# EAGLE schematic MeshPoint.One (EAGLE 9.1.3)

## Sheet 1 of 10: 5V and 3V3 PSU
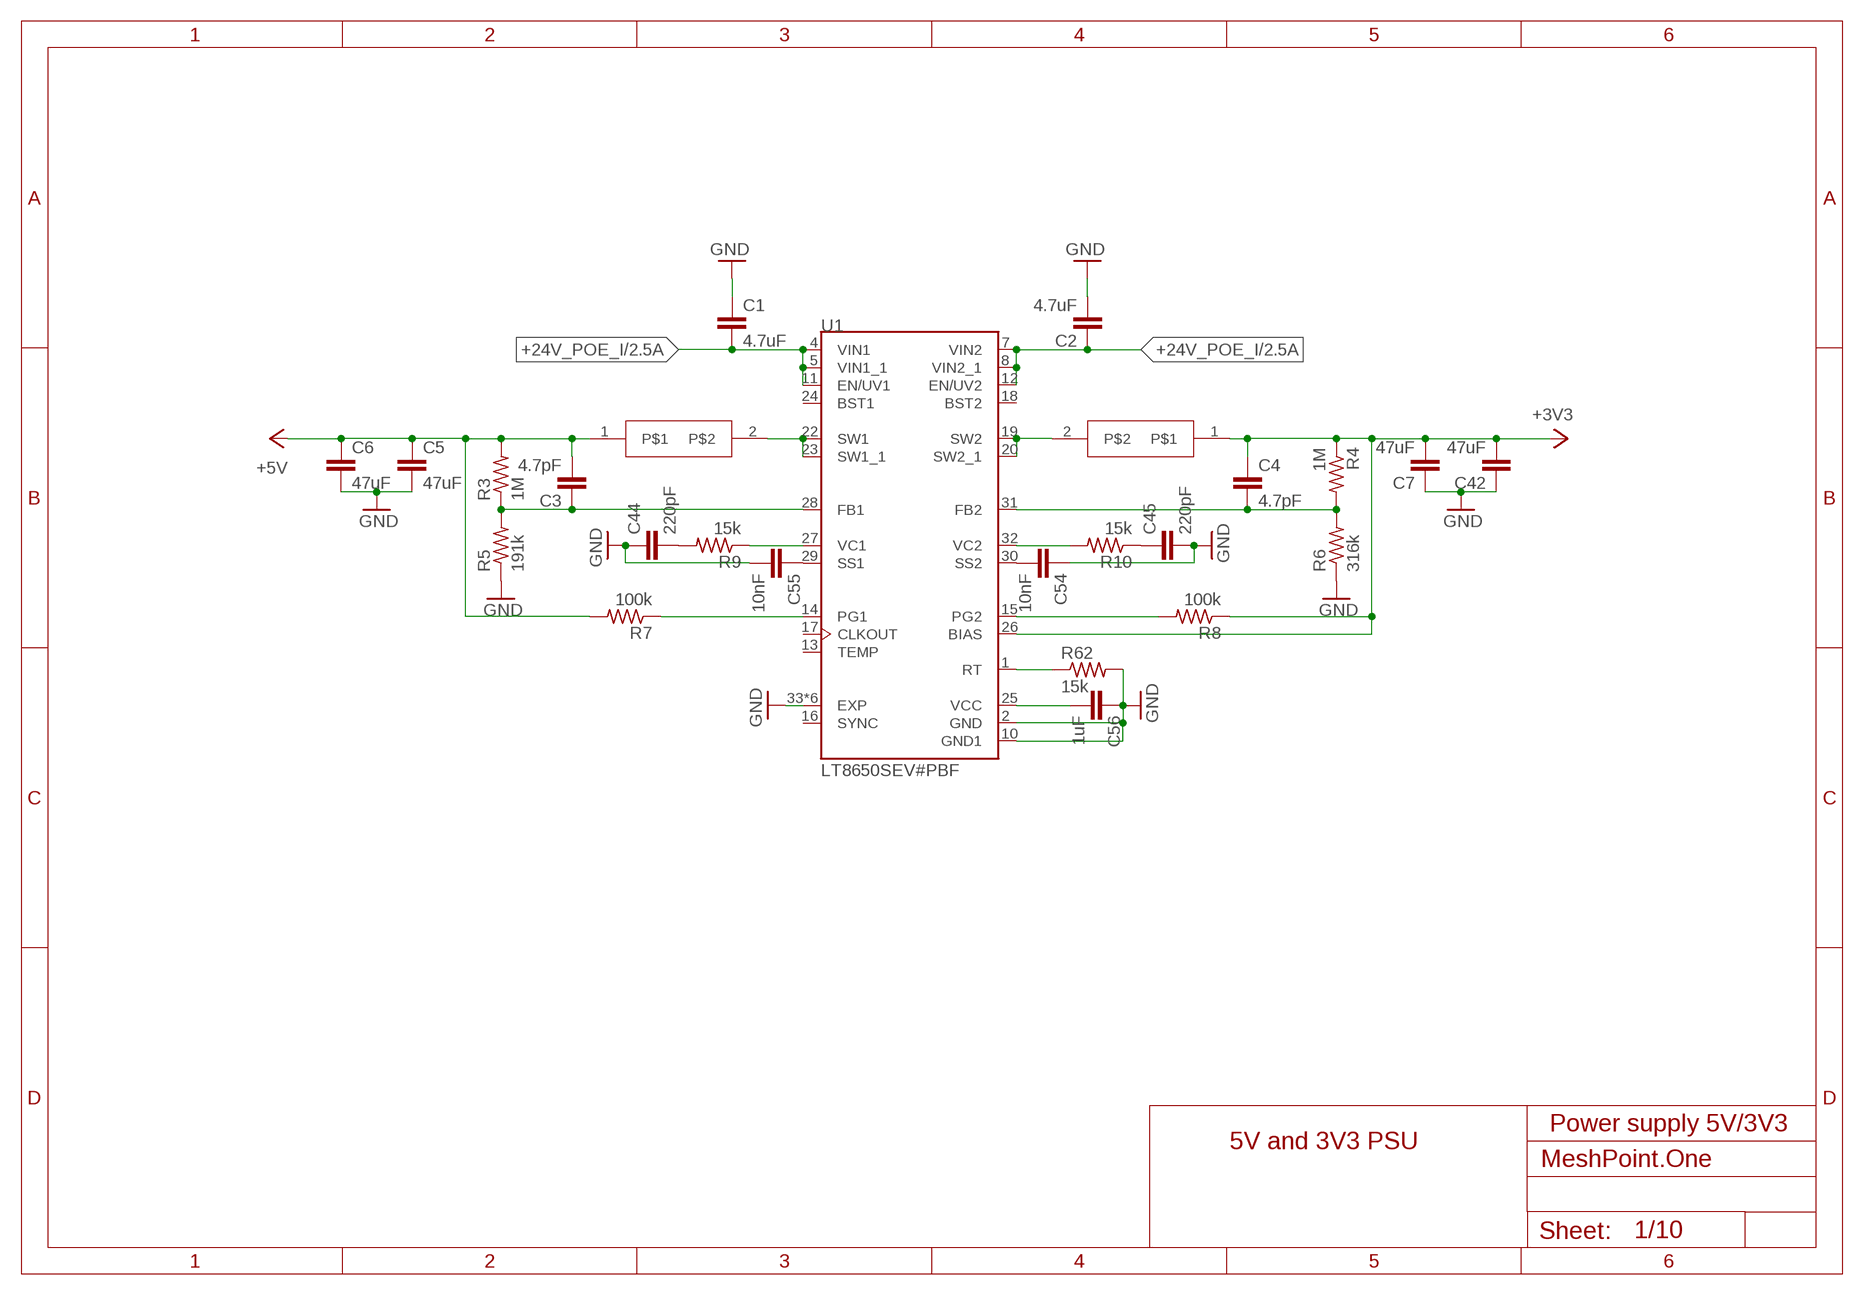
[diagram p0: schematic, sheet 1]

### Parts
C1  4.7uF  C-EUC1206  [C1206]
C2  4.7uF  C-EUC1206  [C1206]
C3  4.7pF  C-EUC0402  [C0402]
C4  4.7pF  C-EUC0402  [C0402]
C5  47uF  C-EUC1206  [C1206]
C6  47uF  C-EUC1206  [C1206]
C7  47uF  C-EUC1206  [C1206]
C42  47uF  C-EUC1206  [C1206]
C44  220pF  C-EUC0402  [C0402]
C45  220pF  C-EUC0402  [C0402]
C54  10nF  C-EUC0402  [C0402]
C55  10nF  C-EUC0402  [C0402]
C56  1uF  C-EUC0402  [C0402]
L1  PA4333.102NLTPA4333.102NLT  [INDC6932X320]
L2  PA4333.102NLTPA4333.102NLT  [INDC6932X320]
R3  1M  R-US_R0402  [R0402]
R4  1M  R-US_R0402  [R0402]
R5  191k  R-US_R0402  [R0402]
R6  316k  R-US_R0402  [R0402]
R7  100k  R-US_R0402  [R0402]
R8  100k  R-US_R0402  [R0402]
R9  15k  R-US_R0402  [R0402]
R10  15k  R-US_R0402  [R0402]
R62  15k  R-US_R0402  [R0402]
U1  LT8650SEV#PBF  [QFN50P600X400X103-32N240X440]

### Nets
+24V_POE_I: C1.2 C2.1 U1.4(VIN1) U1.5(VIN1_1) U1.7(VIN2) U1.8(VIN2_1) U1.11(EN/UV1) U1.12(EN/UV2) ; also sheet 2,3,10
GND: C1.1 C2.2 C5.2 C6.2 C7.1 C42.1 C44.1 C45.2 C54.1 C55.2 C56.1 R5.1 R6.1 R62.2 U1.2(GND) U1.10(GND1) U1.33(EXP) U1.34(EXP) U1.35(EXP) U1.36(EXP) U1.37(EXP) U1.38(EXP) ; also sheet 2,3,4,5,6,7,8,9,10
N$1: L1.2 U1.22(SW1) U1.23(SW1_1)
N$2: L2.2 U1.19(SW2) U1.20(SW2_1)
N$5: C3.1 R3.1 R5.2 U1.28(FB1)
N$6: C4.2 R4.2 R6.2 U1.31(FB2)
N$8: C55.1 U1.29(SS1)
N$9: R7.1 U1.14(PG1)
N$10: R8.2 U1.15(PG2)
N$12: C54.2 U1.30(SS2)
N$13: C44.2 R9.2
N$14: C45.1 R10.1
N$15: R9.1 U1.27(VC1)
N$19: R10.2 U1.32(VC2)
N$28: R62.1 U1.1(RT)
N$30: C56.2 U1.25(VCC)
N$226: C4.1 C7.2 C42.2 L2.1 R4.1 R8.1 U1.26(BIAS) ; supply symbol labelled +3V3 ; also sheet 3,6,7,10
N$301: C3.2 C5.1 C6.1 L1.1 R3.2 R7.2 ; supply symbol labelled +5V ; also sheet 5,10
Unconnected: U1.13(TEMP) U1.16(SYNC) U1.17(CLKOUT) U1.18(BST2) U1.24(BST1)

### Notes on the sheet
- Power supply 5V/3V3
- 5V and 3V3 PSU

## Sheet 2 of 10: POE 24V PSU
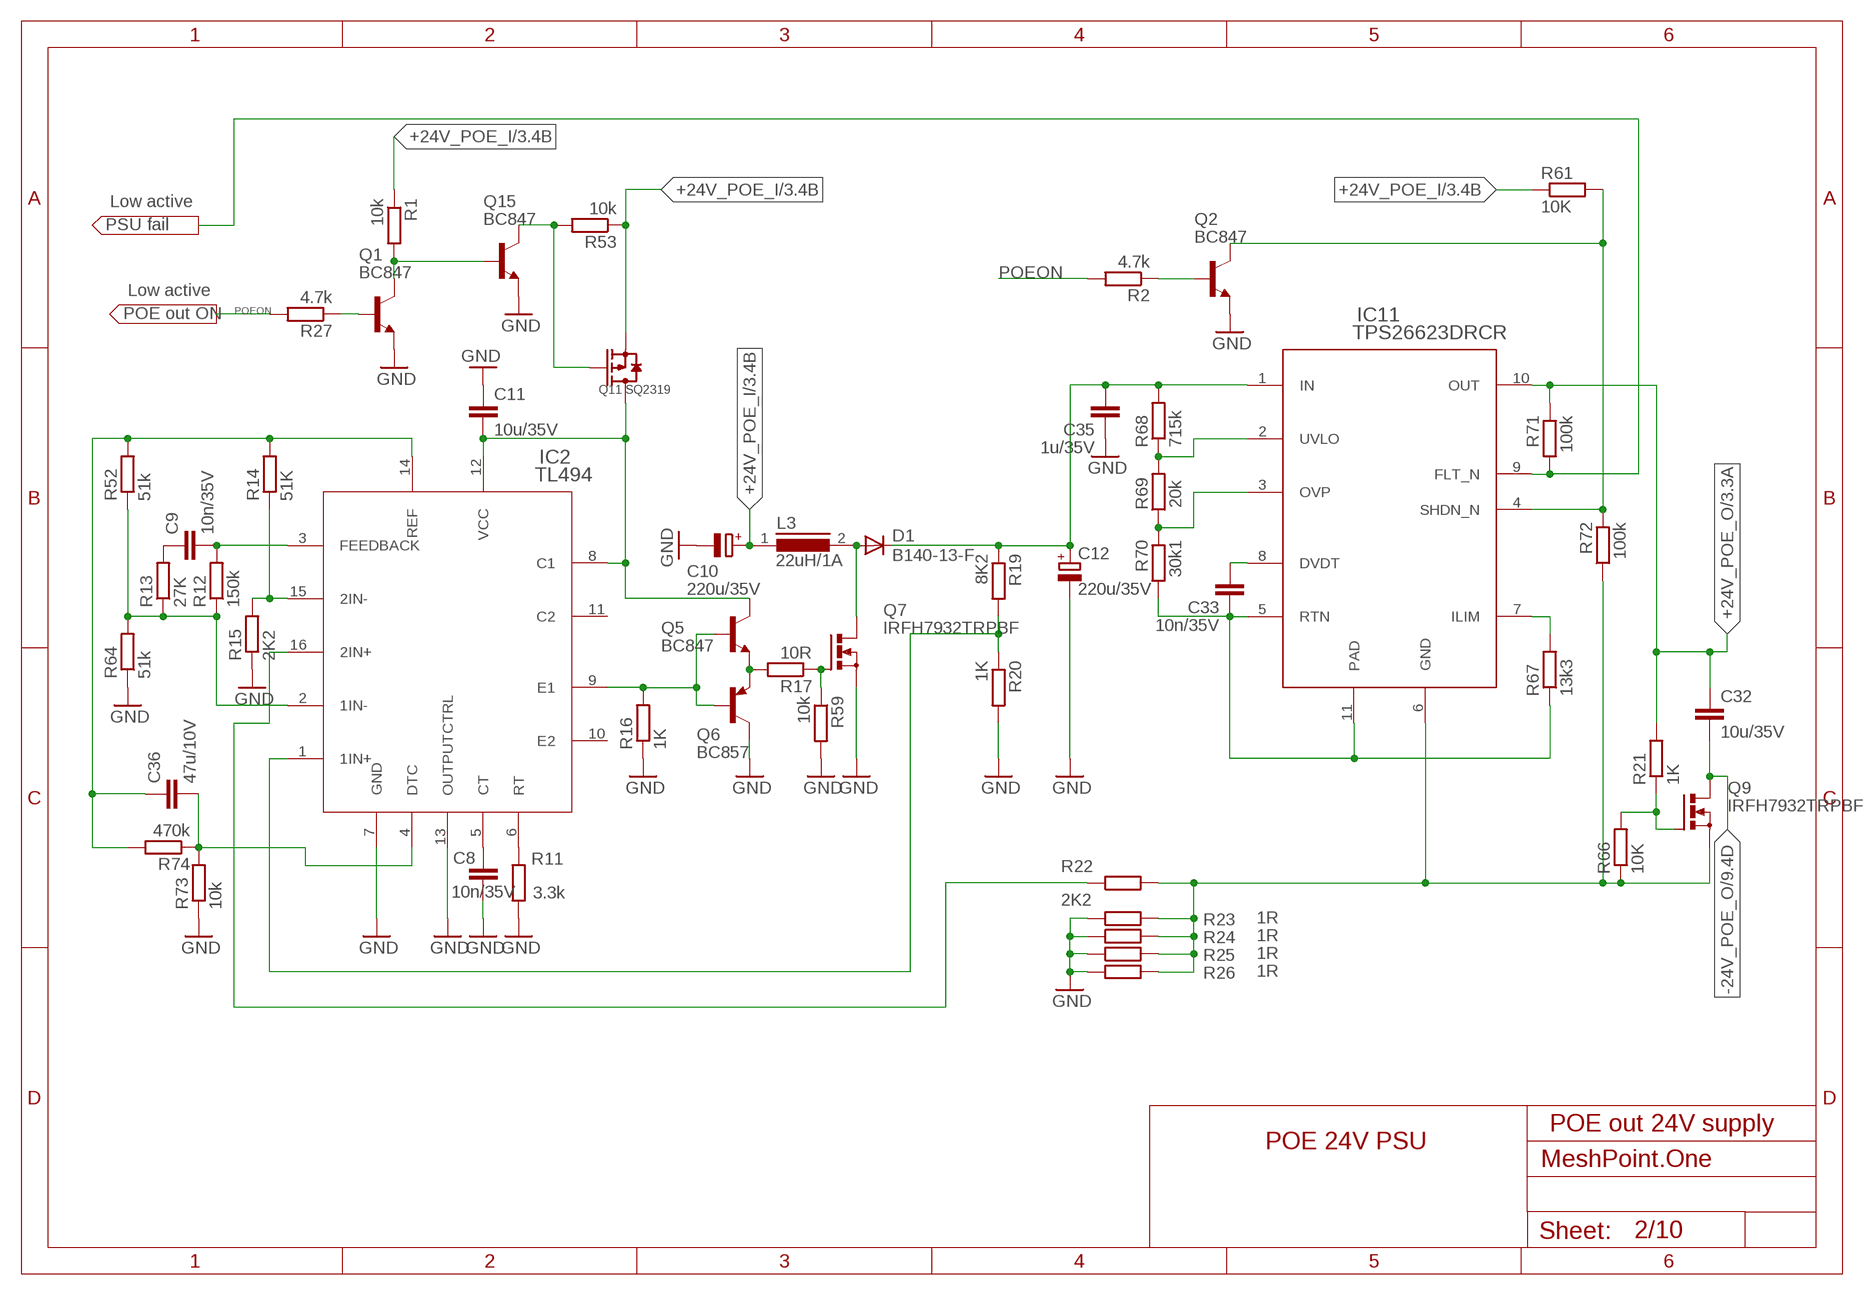
[diagram p1: schematic, sheet 2]

### Parts
C8  10n/35V  C-EUC0402  [C0402]
C9  10n/35V  C-EUC0402  [C0402]
C10  220u/35V  CPOL-EU153CLV-1010  [153CLV-1010]
C11  10u/35V  C-EUC1206  [C1206]
C12  220u/35V  CPOL-EU153CLV-1010  [153CLV-1010]
C32  10u/35V  C-EUC1206  [C1206]
C33  10n/35V  C-EUC0402  [C0402]
C35  1u/35V  C-EUC0402  [C0402]
C36  47u/10V  C-EUC1206  [C1206]
D1  B140-13-F  DIODE-SMB  [SMB]
IC2  TL494  TL494_PW_16  [PW16]
IC11  TPS26623DRCR  [DRC0010J]
L3  22uH/1A  DR125  [DR125]
Q1  BC847  BC847ALT1SMD  [SOT23]
Q2  BC847  BC847ALT1SMD  [SOT23]
Q5  BC847  BC847ASMD  [SOT23]
Q6  BC857  BC857ASMD  [SOT23-BEC]
Q7  IRFH7932TRPBF  BSZ105N04NS  [PG-TDSON-8]
Q9  IRFH7932TRPBF  BSZ105N04NS  [PG-TDSON-8]
Q11  SQ2319  SMD-MOSFET-P-CH-8V-4.1A-CJ2305(SOT-23)  [SOT-23:1]
Q15  BC847  BC847ALT1SMD  [SOT23]
R1  10k  R-EU_R0402  [R0402]
R2  4.7k  R-EU_R0402  [R0402]
R11  3.3k  R-EU_R0402  [R0402]
R12  150k  R-EU_R0402  [R0402]
R13  27K  R-EU_R0402  [R0402]
R14  51K  R-EU_R0402  [R0402]
R15  2K2  R-EU_R0402  [R0402]
R16  1K  R-EU_R0402  [R0402]
R17  10R  R-EU_R0402  [R0402]
R19  8K2  R-EU_R0402  [R0402]
R20  1K  R-EU_R0402  [R0402]
R21  1K  R-EU_R0402  [R0402]
R22  2K2  R-EU_R0402  [R0402]
R23  1R  R-EU_M1206  [M1206]
R24  1R  R-EU_M1206  [M1206]
R25  1R  R-EU_M1206  [M1206]
R26  1R  R-EU_M1206  [M1206]
R27  4.7k  R-EU_R0402  [R0402]
R52  51k  R-EU_R0402  [R0402]
R53  10k  R-EU_R0402  [R0402]
R59  10k  R-EU_R0402  [R0402]
R61  10K  R-EU_R0402  [R0402]
R64  51k  R-EU_R0402  [R0402]
R66  10K  R-EU_R0402  [R0402]
R67  13k3  R-EU_R0402  [R0402]
R68  715k  R-EU_R0402  [R0402]
R69  20k  R-EU_R0402  [R0402]
R70  30k1  R-EU_R0402  [R0402]
R71  100k  R-EU_R0402  [R0402]
R72  100k  R-EU_R0402  [R0402]
R73  10k  R-EU_R0402  [R0402]
R74  470k  R-EU_R0402  [R0402]

### Nets
+24V_POE_I: C10.+ L3.1 Q11.2(S) R1.1 R53.1 R61.1 ; also sheet 1,3,10
+24V_POE_O: C32.1 IC11.10(OUT) R21.2 R71.2 ; also sheet 3,10
-24V_POE_O: C32.2 Q9.5(D) Q9.6(D) Q9.7(D) Q9.8(D) Q9.TH(D) ; also sheet 9,10
GND: C8.2 C10.- C11.1 C12.- C35.1 IC2.7(GND) IC2.13(OUTPUTCTRL) Q1.2(E) Q2.2(E) Q6.C Q7.1(S) Q7.2(S) Q7.3(S) Q15.2(E) R11.1 R15.1 R16.1 R20.2 R23.1 R24.1 R25.1 R26.1 R59.2 R64.1 R73.1 ; also sheet 1,3,4,5,6,7,8,9,10
N$11: IC2.6(RT) R11.2
N$16: C8.1 IC2.5(CT)
N$17: C36.2 IC2.4(DTC) R73.2 R74.1
N$18: C9.2 IC2.3(FEEDBACK) R12.2
N$21: Q1.1(B) R27.1
N$22: IC2.15(2IN-) R14.1 R15.2
N$23: IC2.9(E1) Q5.1(B) Q6.B R16.2
N$24: Q5.2(E) Q6.E R17.2
N$25: C36.1 IC2.14(REF) R14.2 R52.2 R74.2
N$27: Q7.4(G) R17.1 R59.1
N$31: IC2.1(1IN+) R19.2 R20.1
N$32: C33.2 IC11.8(DVDT)
N$35: IC2.16(2IN+) R22.1
N$37: Q1.3(C) Q15.1(B) R1.2
N$73: Q2.1(B) R2.1
N$74: C9.1 R13.2
N$89: IC11.4(SHDN_N) Q2.3(C) R61.2 R72.2
N$91: C12.+ C35.2 D1.C IC11.1(IN) R19.1 R68.2
N$113: Q11.1(G) Q15.3(C) R53.2
N$115: C11.2 IC2.8(C1) IC2.12(VCC) Q5.3(C) Q11.3(D)
N$128: Q9.4(G) R21.1 R66.2
N$186: IC11.7(ILIM) R67.2
N$190: D1.A L3.2 Q7.5(D) Q7.6(D) Q7.7(D) Q7.8(D) Q7.TH(D)
N$194: C33.1 IC11.5(RTN) IC11.11(PAD) R67.1 R70.1
N$208: IC11.6(GND) Q9.1(S) Q9.2(S) Q9.3(S) R22.2 R23.2 R24.2 R25.2 R26.2 R66.1 R72.1
N$234: IC2.2(1IN-) R12.1 R13.1 R52.1 R64.2
N$249: IC11.2(UVLO) R68.1 R69.2
N$250: IC11.3(OVP) R69.1 R70.2
POEON: R2.2 R27.2 ; also sheet 10
PSU_FAIL: IC11.9(FLT_N) R71.1
Unconnected: IC2.10(E2) IC2.11(C2)

### Notes on the sheet
- Low active
- Low active
- POE out 24V supply
- POE 24V PSU

## Sheet 3 of 10: INA voltage/current monitor
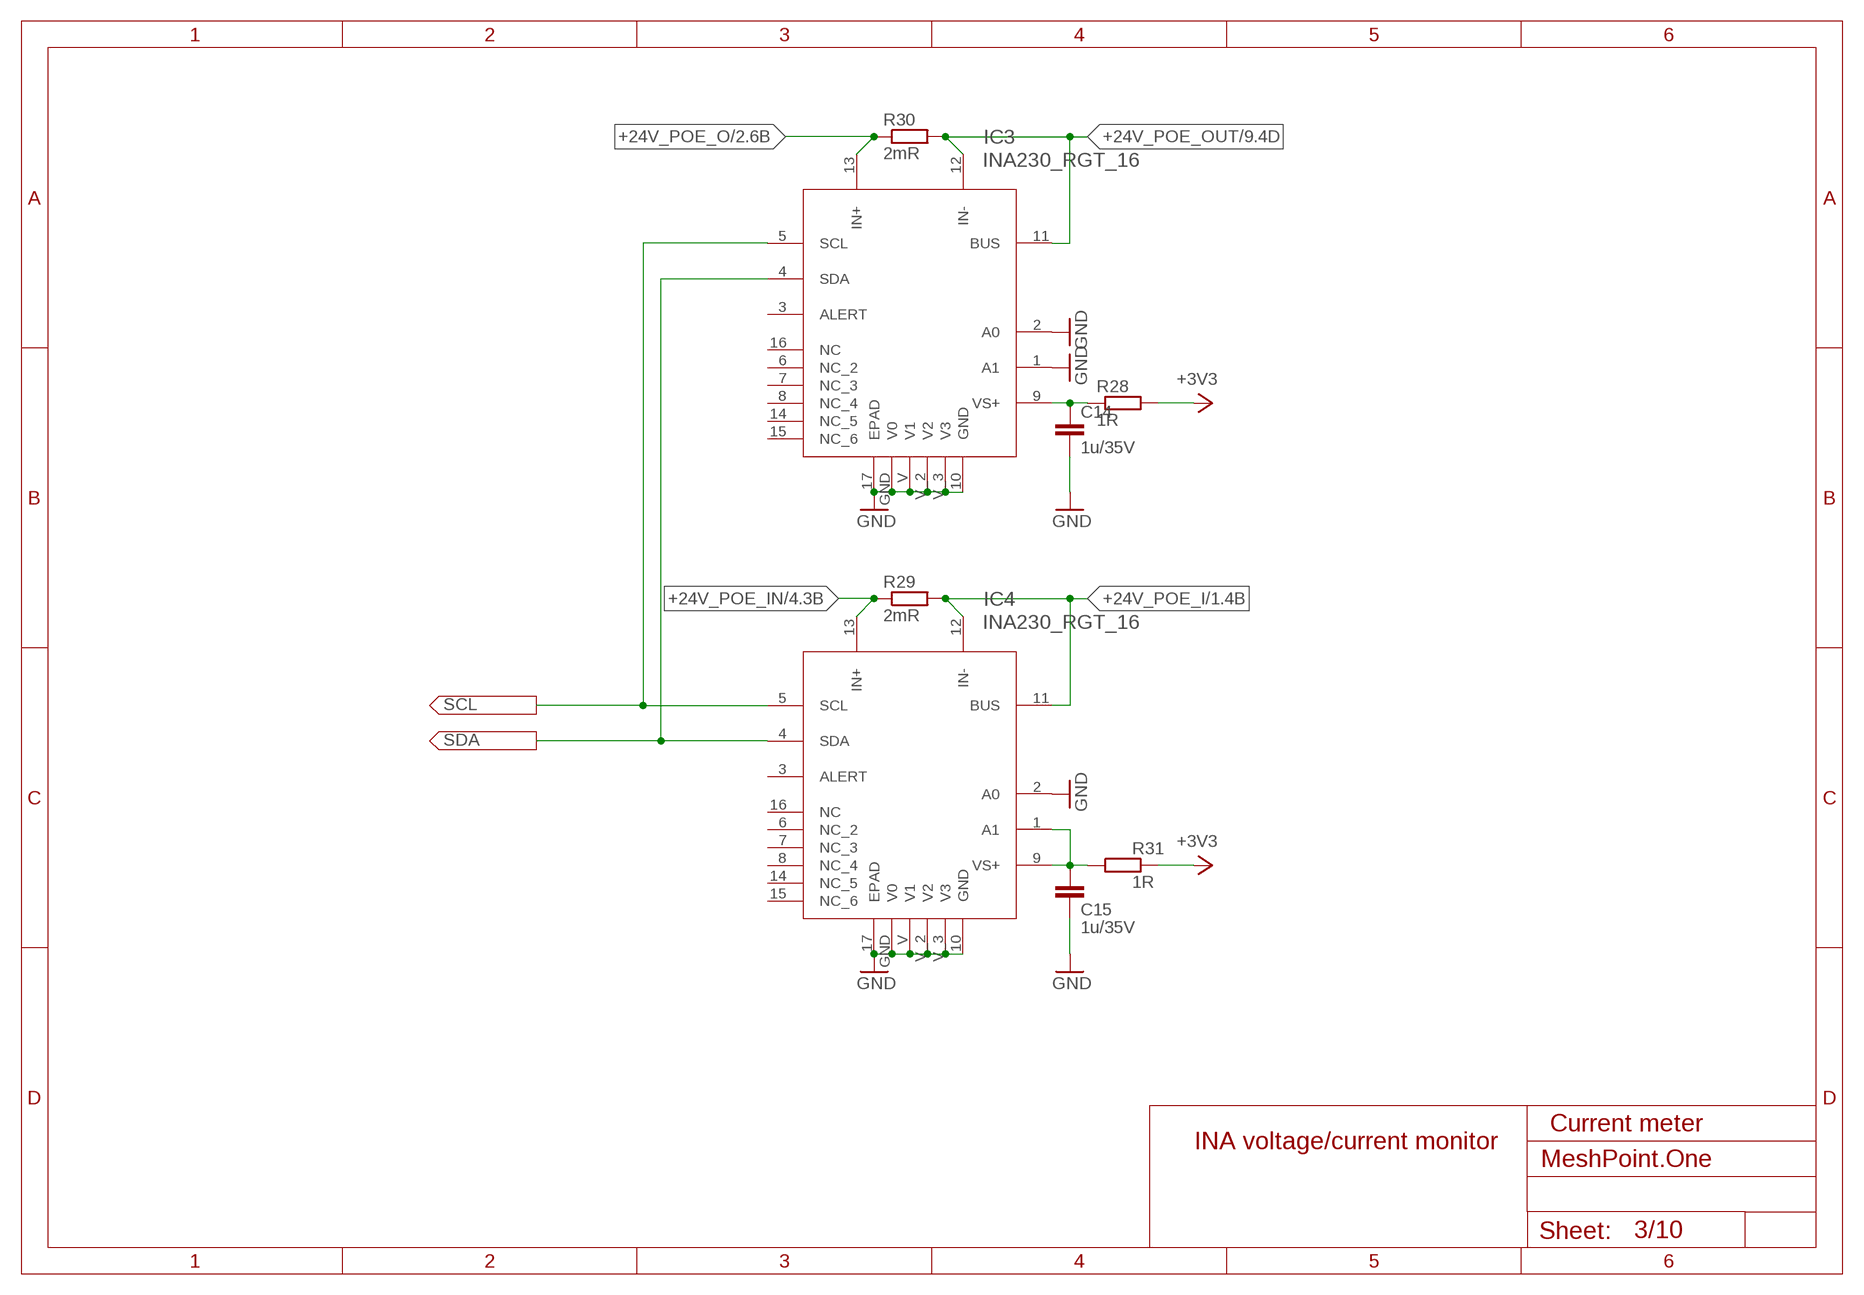
[diagram p2: schematic, sheet 3]

### Parts
C14  1u/35V  C-EUC0402  [C0402]
C15  1u/35V  C-EUC0402  [C0402]
IC3  INA230_RGT_16  [RGT16_1P7X1P7]
IC4  INA230_RGT_16  [RGT16_1P7X1P7]
R28  1R  R-EU_R0402  [R0402]
R29  2mR  R-EU_M1206  [M1206]
R30  2mR  R-EU_M1206  [M1206]
R31  1R  R-EU_R0402  [R0402]

### Nets
+24V_POE_I: IC4.11(BUS) IC4.12(IN-) R29.2 ; also sheet 1,2,10
+24V_POE_IN: IC4.13(IN+) R29.1 ; also sheet 4,8
+24V_POE_O: IC3.13(IN+) R30.1 ; also sheet 2,10
+24V_POE_OUT: IC3.11(BUS) IC3.12(IN-) R30.2 ; also sheet 9
GND: C14.2 C15.2 IC3.1(A1) IC3.2(A0) IC3.10(GND) IC3.17(EPAD) IC3.GND(V0) IC3.V(V1) IC3.V_2(V2) IC3.V_3(V3) IC4.2(A0) IC4.10(GND) IC4.17(EPAD) IC4.GND(V0) IC4.V(V1) IC4.V_2(V2) IC4.V_3(V3) ; also sheet 1,2,4,5,6,7,8,9,10
N$34: C14.1 IC3.9(VS+) R28.1
N$36: C15.1 IC4.1(A1) IC4.9(VS+) R31.1
N$226: R28.2 R31.2 ; supply symbol labelled +3V3 ; also sheet 1,6,7,10
SCL: IC3.5(SCL) IC4.5(SCL) ; also sheet 4,6,7,10
SDA: IC3.4(SDA) IC4.4(SDA) ; also sheet 4,6,7,10
Unconnected: IC3.3(ALERT) IC3.6(NC_2) IC3.7(NC_3) IC3.8(NC_4) IC3.14(NC_5) IC3.15(NC_6) IC3.16(NC) IC4.3(ALERT) IC4.6(NC_2) IC4.7(NC_3) IC4.8(NC_4) IC4.14(NC_5) IC4.15(NC_6) IC4.16(NC)

### Notes on the sheet
- Current meter
- INA voltage/current monitor

## Sheet 4 of 10: POE/BATT power selector
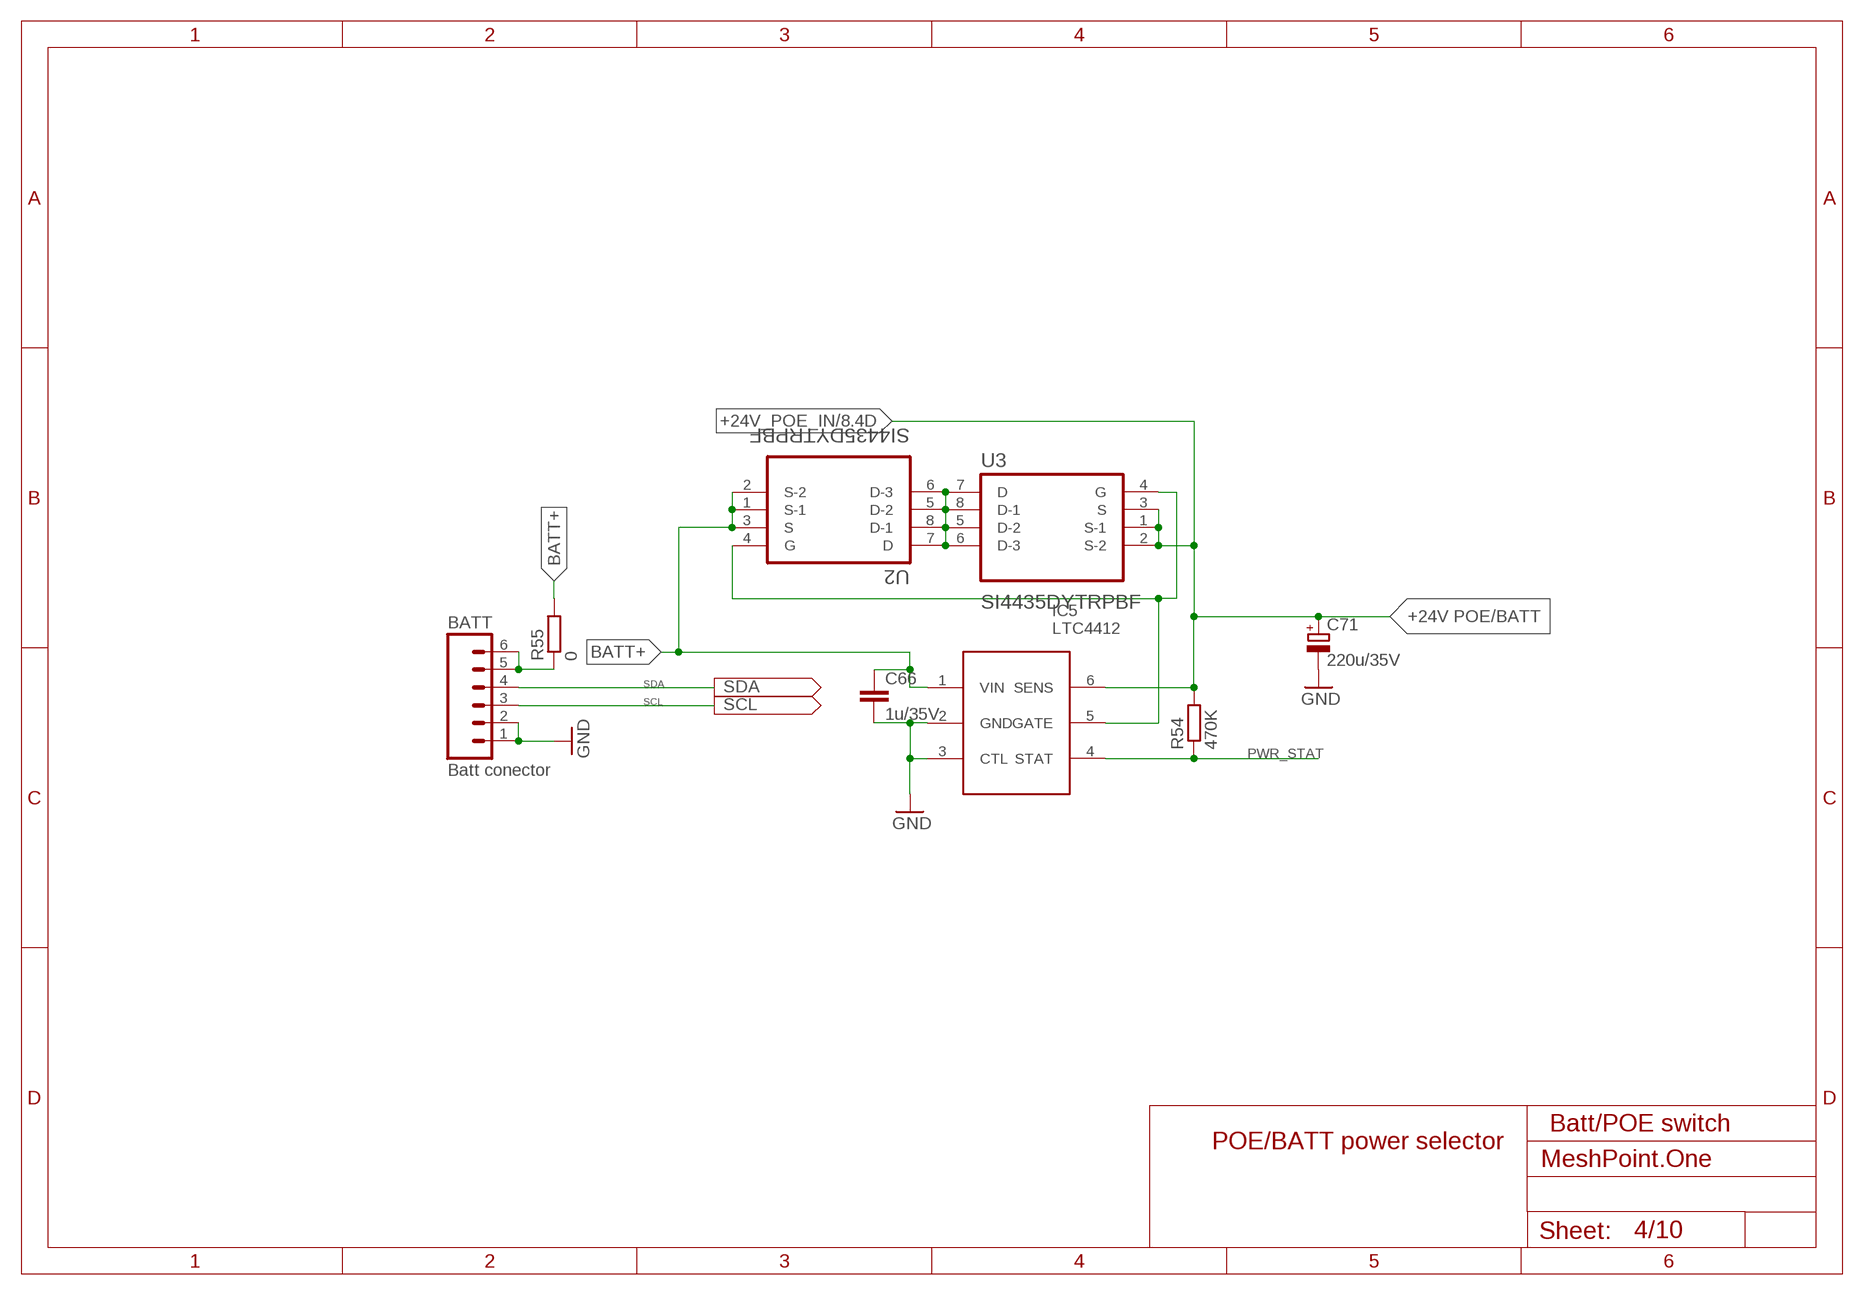
[diagram p3: schematic, sheet 4]

### Parts
BATT  Batt conector  M06  [06P]
C66  1u/35V  C-EUC0402  [C0402]
C71  220u/35V  CPOL-EU153CLV-1010  [153CLV-1010]
IC5  LTC4412  [TSOT23]
R54  470K  R-EU_R0402  [R0402]
R55  0  R-EU_M0805  [M0805]
U2  SI4435DYTRPBF  [SOIC127P490X600X175-8N]
U3  SI4435DYTRPBF  [SOIC127P490X600X175-8N]

### Nets
+24V_POE_IN: C71.+ IC5.6(SENS) R54.2 U3.1(S-1) U3.2(S-2) U3.3(S) ; also sheet 3,8
BATT+: C66.1 IC5.1(VIN) R55.2 U2.1(S-1) U2.2(S-2) U2.3(S)
GND: BATT.1 BATT.2 C66.2 C71.- IC5.2(GND) IC5.3(CTL) ; also sheet 1,2,3,5,6,7,8,9,10
N$44: U2.5(D-2) U2.6(D-3) U2.7(D) U2.8(D-1) U3.5(D-2) U3.6(D-3) U3.7(D) U3.8(D-1)
N$92: IC5.5(GATE) U2.4(G) U3.4(G)
N$100: BATT.5 BATT.6 R55.1
PWR_STAT: IC5.4(STAT) R54.1
SCL: BATT.3 ; also sheet 3,6,7,10
SDA: BATT.4 ; also sheet 3,6,7,10

### Notes on the sheet
- +24V POE/BATT
- Batt/POE switch
- POE/BATT power selector

## Sheet 5 of 10: USB PSU and filters
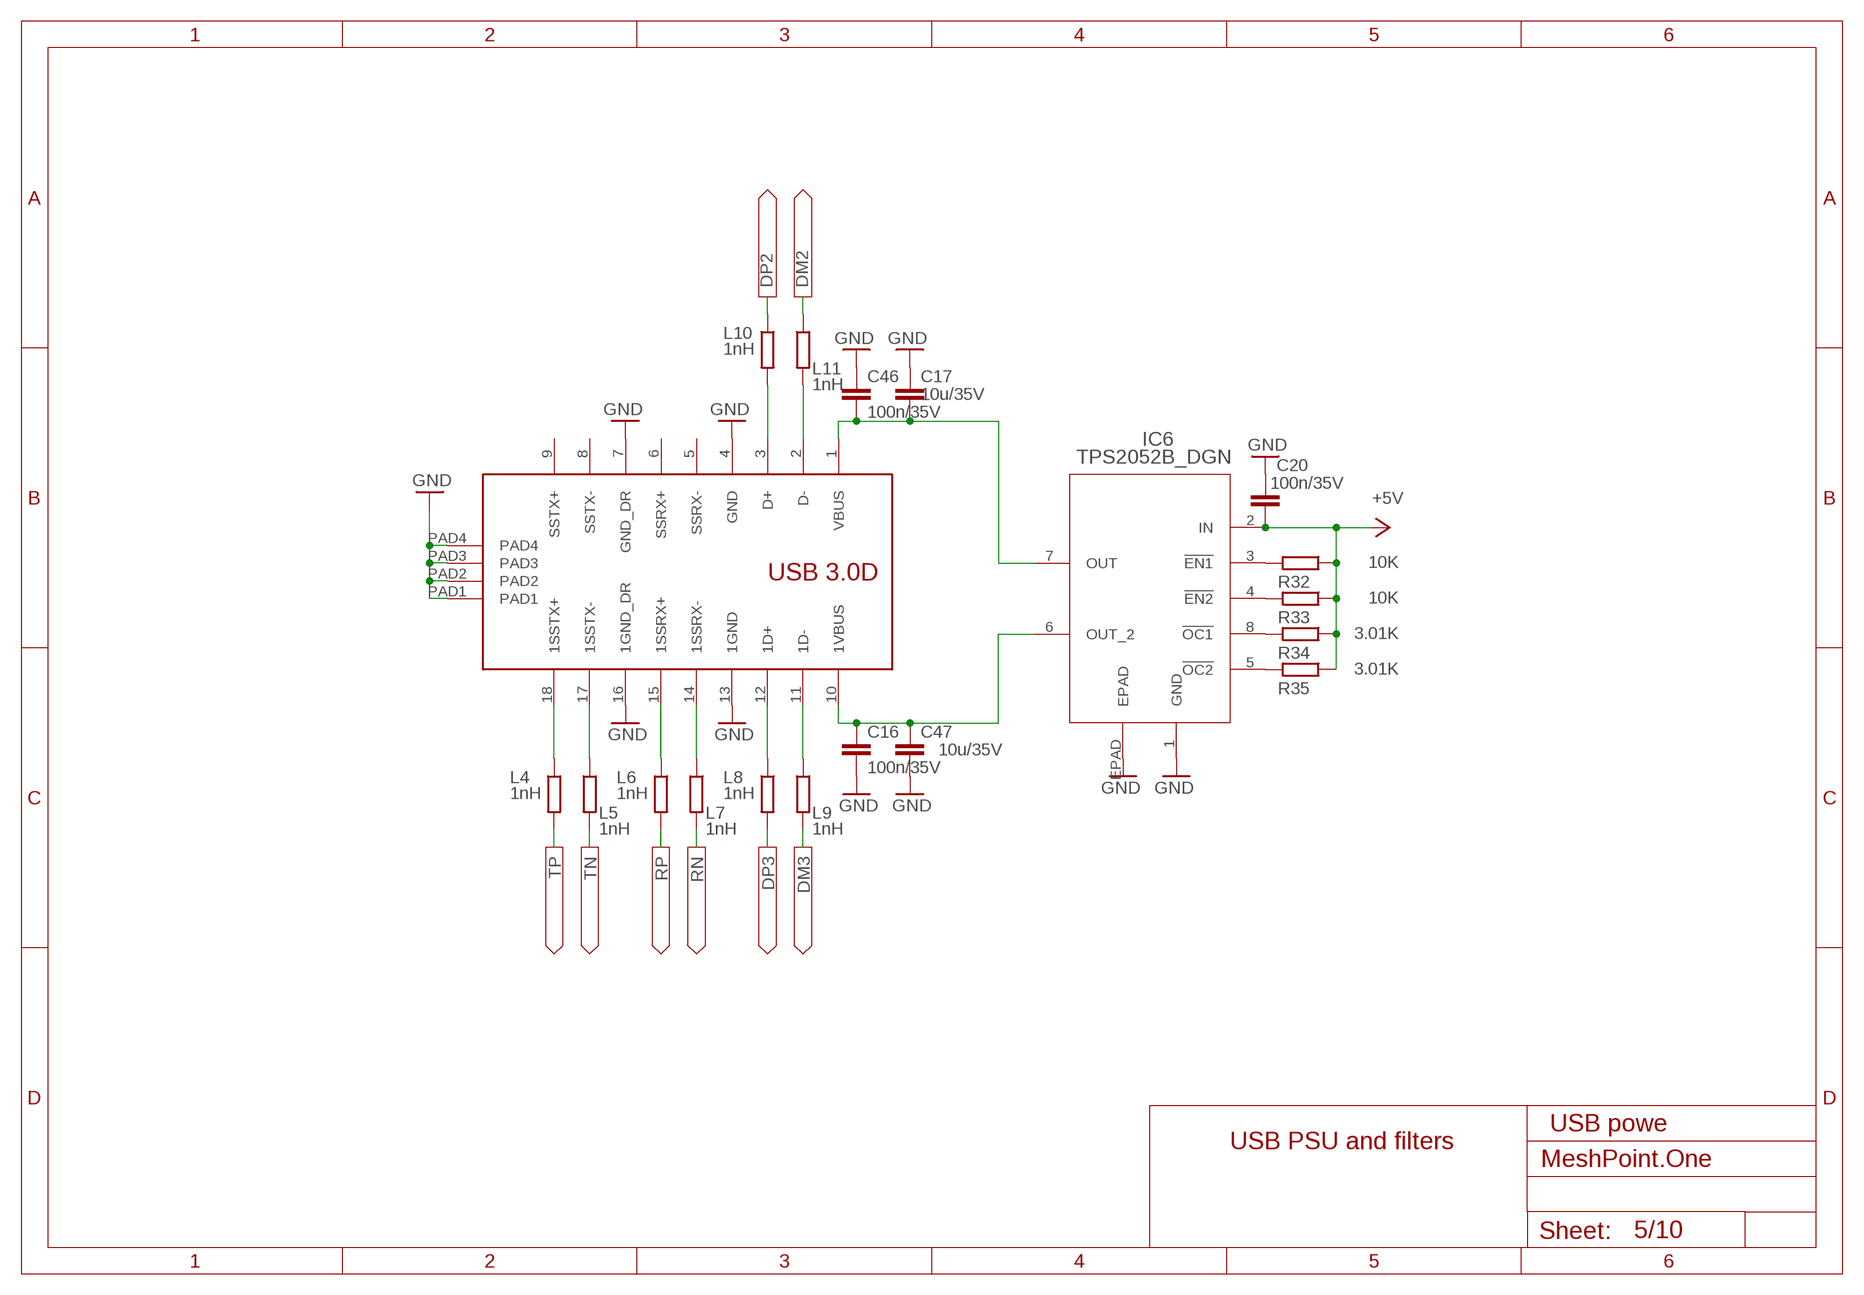
[diagram p4: schematic, sheet 5]

### Parts
C16  100n/35V  C-EUC0402  [C0402]
C17  10u/35V  C-EUC1206  [C1206]
C20  100n/35V  C-EUC0402  [C0402]
C46  100n/35V  C-EUC0402  [C0402]
C47  10u/35V  C-EUC1206  [C1206]
IC6  TPS2052B_DGN  TPS2052B_DGN_8  [DGN8_1P89X1P57]
L4  1nH  R-EU_R0402  [R0402]
L5  1nH  R-EU_R0402  [R0402]
L6  1nH  R-EU_R0402  [R0402]
L7  1nH  R-EU_R0402  [R0402]
L8  1nH  R-EU_R0402  [R0402]
L9  1nH  R-EU_R0402  [R0402]
L10  1nH  R-EU_R0402  [R0402]
L11  1nH  R-EU_R0402  [R0402]
R32  10K  R-EU_R0402  [R0402]
R33  10K  R-EU_R0402  [R0402]
R34  3.01K  R-EU_R0402  [R0402]
R35  3.01K  R-EU_R0402  [R0402]
USB3.0  USB3.0D  [USB3.0D]

### Nets
DM2: L11.1 ; also sheet 10
DM3: L9.2 ; also sheet 10
DP2: L10.1 ; also sheet 10
DP3: L8.2 ; also sheet 10
GND: C16.2 C17.1 C20.1 C46.1 C47.2 IC6.1(GND) IC6.EPAD USB3.0.4(GND) USB3.0.7(GND_DR) USB3.0.13(1GND) USB3.0.16(1GND_DR) USB3.0.PAD1 USB3.0.PAD2 USB3.0.PAD3 USB3.0.PAD4 ; also sheet 1,2,3,4,6,7,8,9,10
N$29: L4.1 USB3.0.18(1SSTX+)
N$38: L5.1 USB3.0.17(1SSTX-)
N$39: L6.1 USB3.0.15(1SSRX+)
N$40: L7.1 USB3.0.14(1SSRX-)
N$41: L8.1 USB3.0.12(1D+)
N$42: L9.1 USB3.0.11(1D-)
N$58: IC6.3(!EN1) R32.2
N$59: IC6.4(!EN2) R33.2
N$60: IC6.8(!OC1) R34.2
N$61: IC6.5(!OC2) R35.2
N$120: C16.1 C47.1 IC6.6(OUT_2) USB3.0.10(1VBUS)
N$187: L10.2 USB3.0.3(D+)
N$201: L11.2 USB3.0.2(D-)
N$283: C17.2 C46.2 IC6.7(OUT) USB3.0.1(VBUS)
N$301: C20.2 IC6.2(IN) R32.1 R33.1 R34.1 R35.1 ; supply symbol labelled +5V ; also sheet 1,10
RN: L7.2 ; also sheet 10
RP: L6.2 ; also sheet 10
TN: L5.2 ; also sheet 10
TP: L4.2 ; also sheet 10
Unconnected: USB3.0.5(SSRX-) USB3.0.6(SSRX+) USB3.0.8(SSTX-) USB3.0.9(SSTX+)

### Notes on the sheet
- USB powe
- USB PSU and filters

## Sheet 6 of 10: USB UART
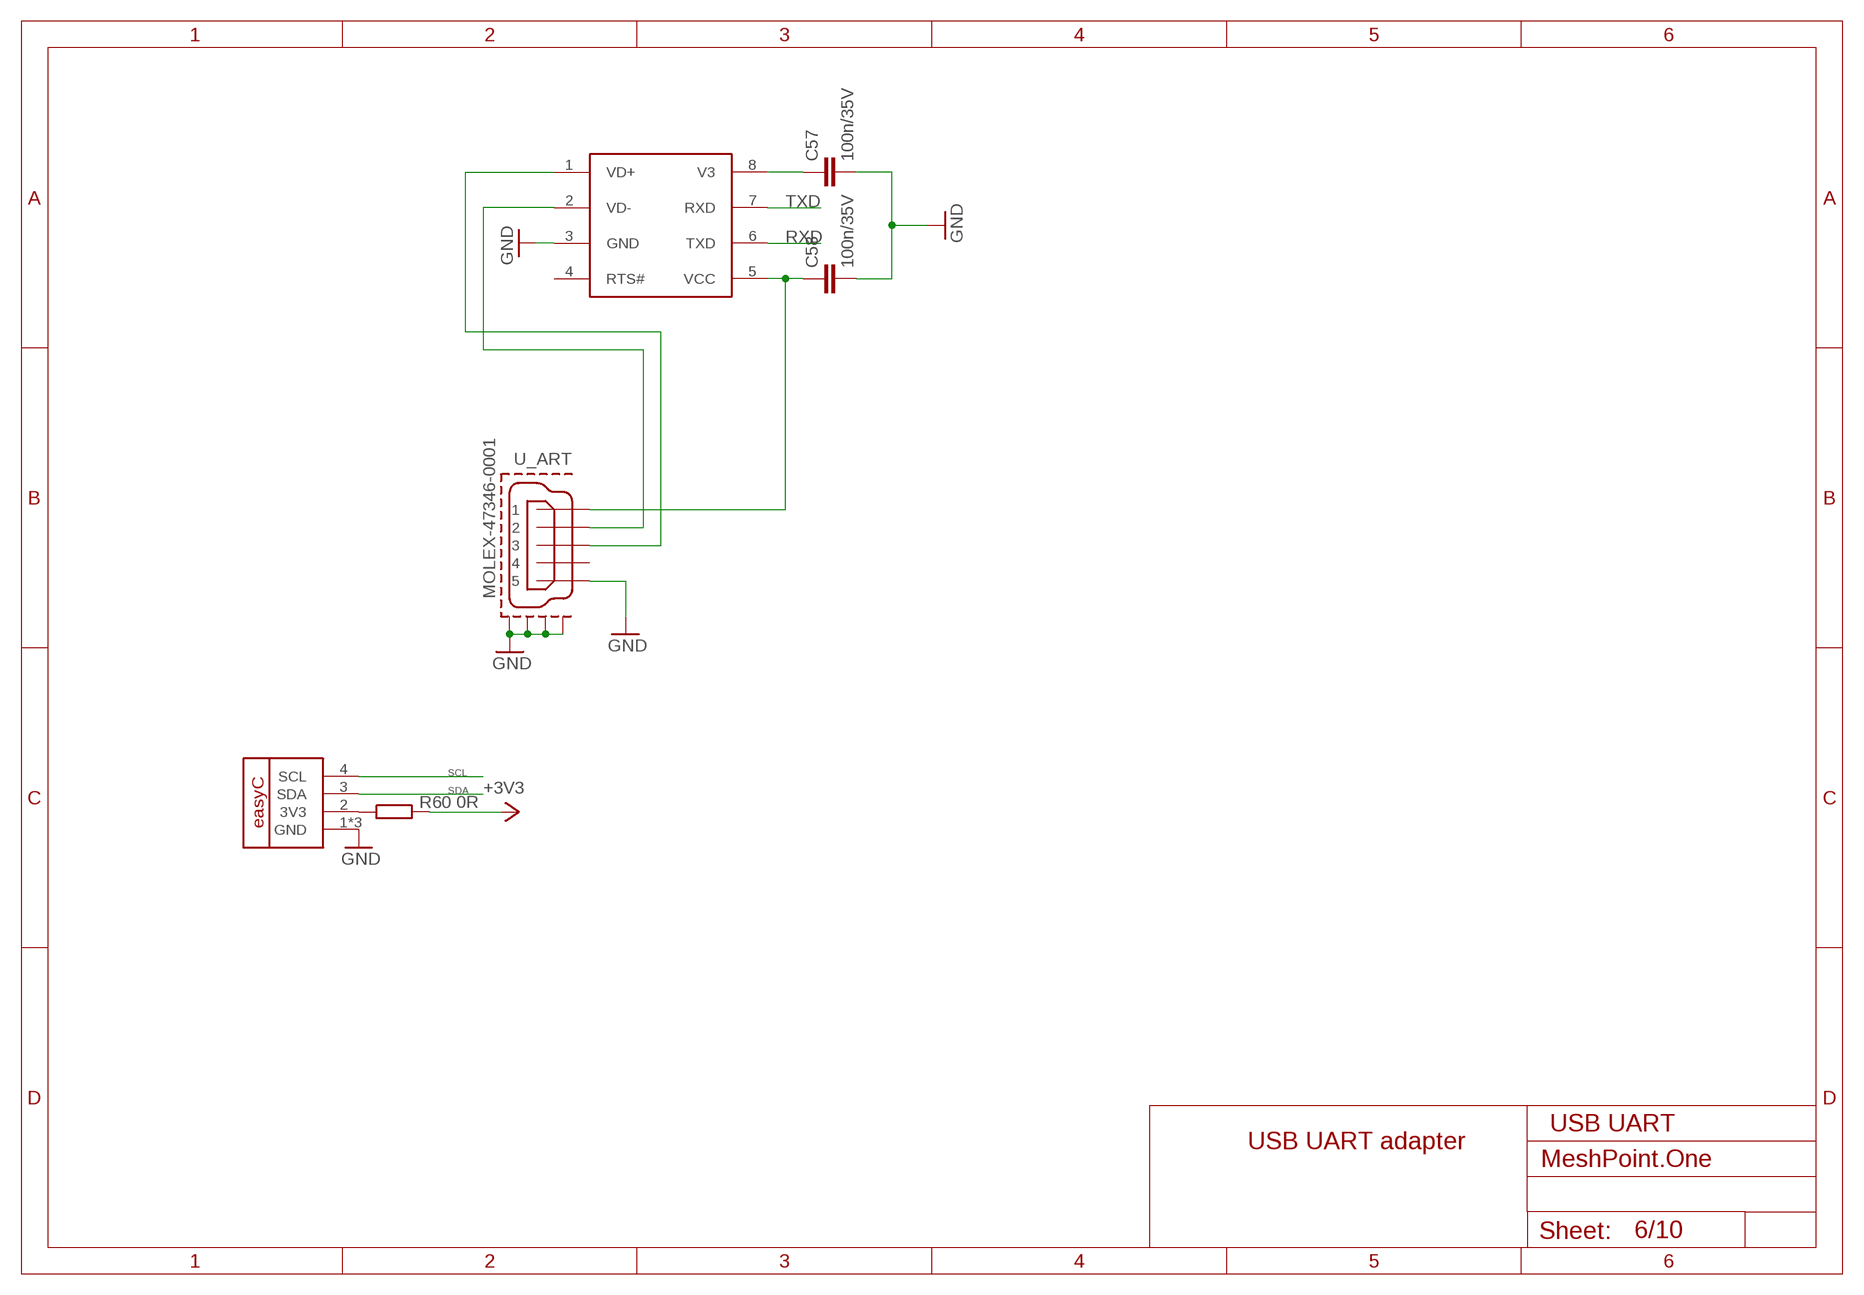
[diagram p5: schematic, sheet 6]

### Parts
C57  100n/35V  C-EUC0402  [C0402]
C58  100n/35V  C-EUC0402  [C0402]
CN2  EASYC  [EASYC]
IC10  CH330N  [SOIC127P600X175-8]
R60  0R  R-EU_R0805  [R0805]
U_ART  MOLEX-47346-0001  [MOLEX-47364-0001]

### Nets
GND: C57.2 C58.2 CN2.1(GND) CN2.NC1(GND) CN2.NC2(GND) IC10.3(GND) U_ART.5 U_ART.GND1 U_ART.GND2 U_ART.GND3 U_ART.GND4 ; also sheet 1,2,3,4,5,7,8,9,10
N$71: C57.1 IC10.8(V3)
N$78: C58.1 IC10.5(VCC) U_ART.1
N$226: R60.2 ; supply symbol labelled +3V3 ; also sheet 1,3,7,10
N$252: CN2.2(3V3) R60.1
N$290: IC10.2(VD-) U_ART.2
N$292: IC10.1(VD+) U_ART.3
RXD: IC10.6(TXD) ; also sheet 10
SCL: CN2.4(SCL) ; also sheet 3,4,7,10
SDA: CN2.3(SDA) ; also sheet 3,4,7,10
TXD: IC10.7(RXD) ; also sheet 10
Unconnected: IC10.4(RTS#) U_ART.4

### Notes on the sheet
- USB UART
- USB UART adapter

## Sheet 7 of 10: BME 280 and RTC
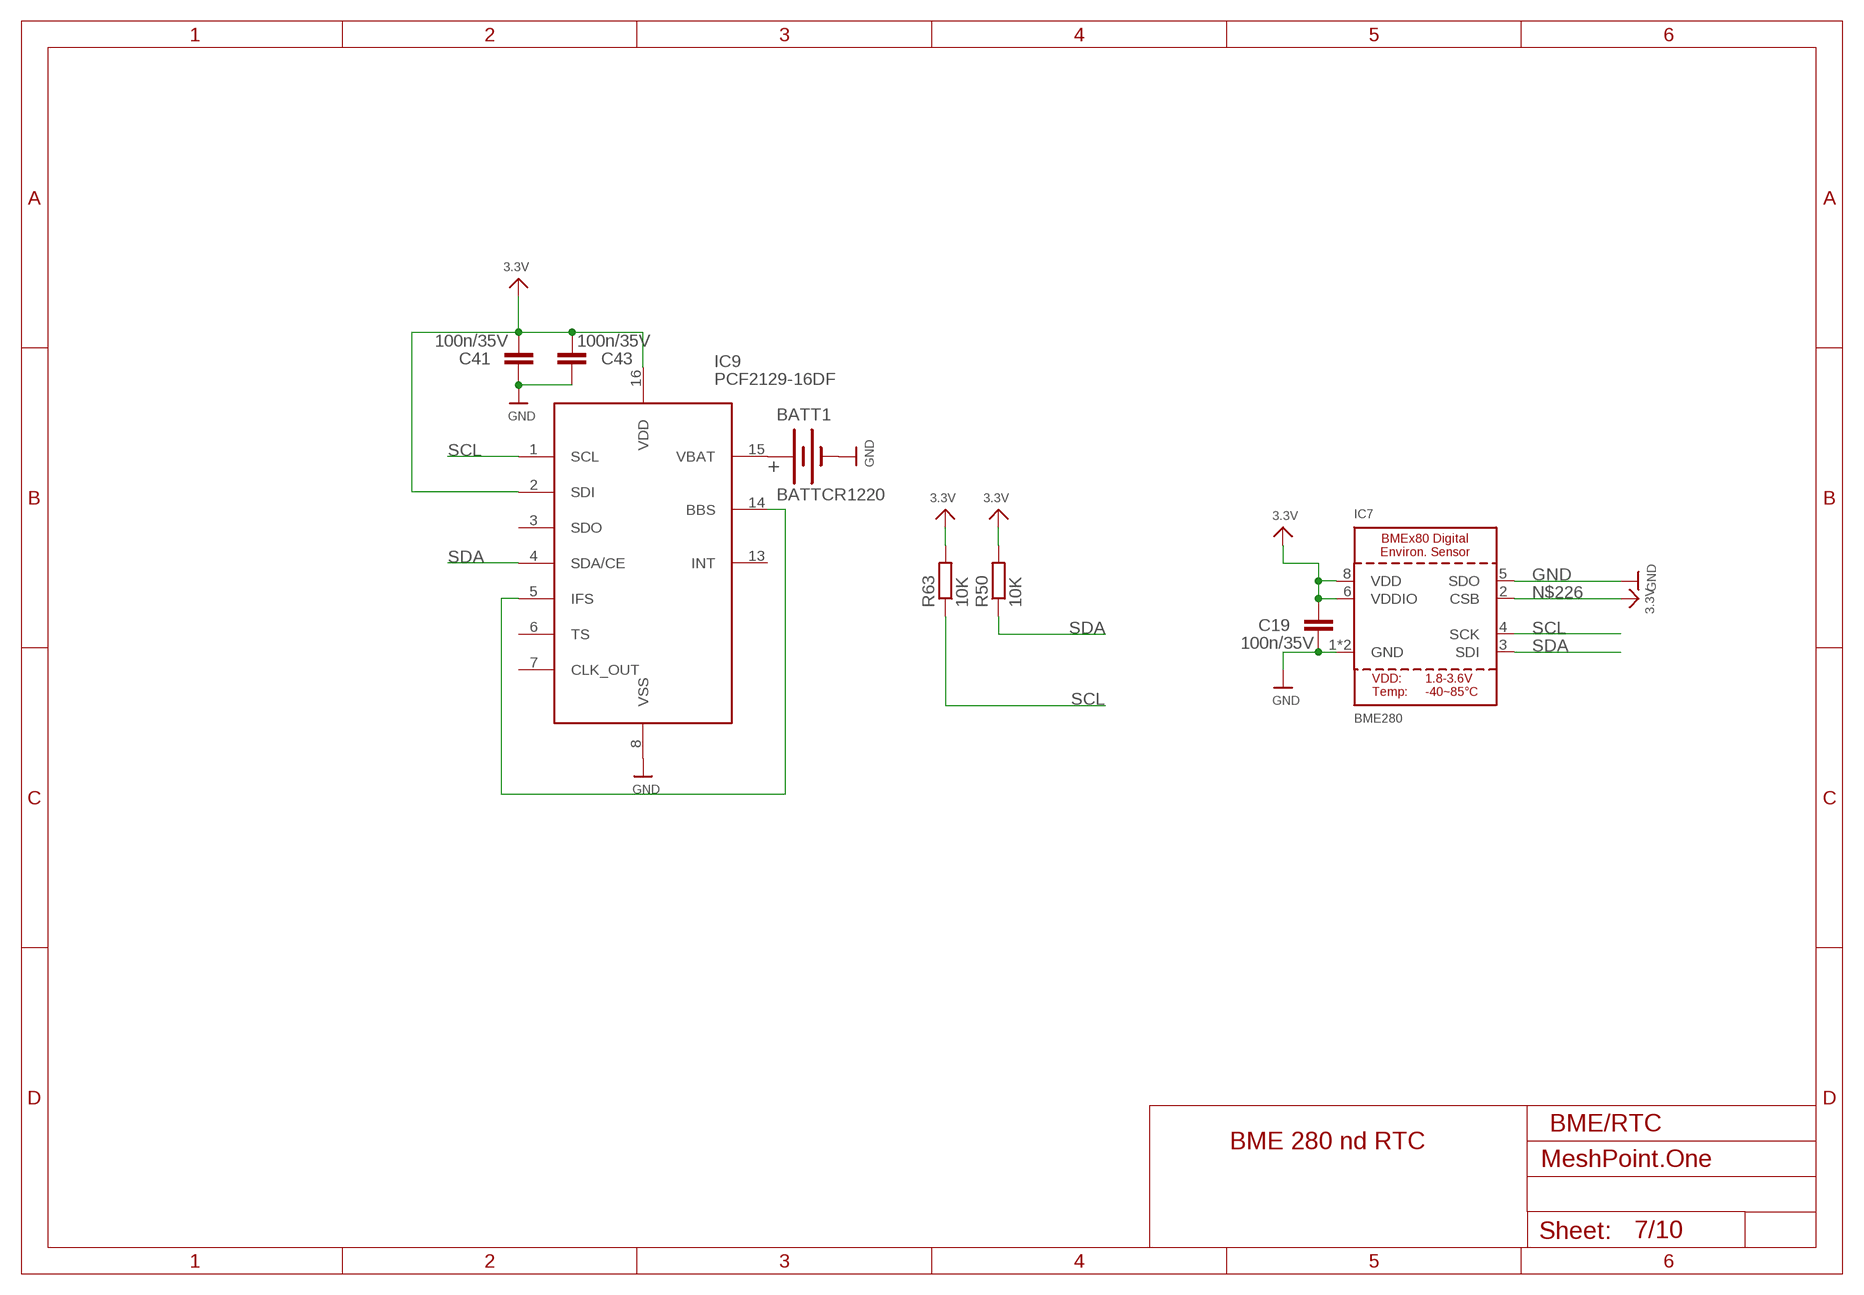
[diagram p6: schematic, sheet 7]

### Parts
BATT1  BATTCR1220  BATERIJA_CR1220  [BATERIJA12MM]
C19  100n/35V  C-EUC0402  [C0402]
C41  100n/35V  C-EUC0402  [C0402]
C43  100n/35V  C-EUC0402  [C0402]
IC7  BME280  [BME280]
IC9  PCF2129-16DF  [SO16DF]
R50  10K  R-EU_R0402  [R0402]
R63  10K  R-EU_R0402  [R0402]

### Nets
GND: BATT1.- C19.2 C41.1 C43.1 IC7.1(GND) IC7.5(SDO) IC7.7(GND) IC9.8(VSS) ; also sheet 1,2,3,4,5,6,8,9,10
N$116: BATT1.+ IC9.15(VBAT)
N$226: C19.1 C41.2 C43.2 IC7.2(CSB) IC7.6(VDDIO) IC7.8(VDD) IC9.2(SDI) IC9.16(VDD) R50.2 R63.2 ; supply symbol labelled 3.3V ; also sheet 1,3,6,10
N$230: IC9.5(IFS) IC9.14(BBS)
SCL: IC7.4(SCK) IC9.1(SCL) R63.1 ; also sheet 3,4,6,10
SDA: IC7.3(SDI) IC9.4(SDA/CE) R50.1 ; also sheet 3,4,6,10
Unconnected: IC9.3(SDO) IC9.6(TS) IC9.7(CLK_OUT) IC9.13(INT)

### Notes on the sheet
- BME/RTC
- BME 280 nd RTC

## Sheet 8 of 10: POE in and WAN filter
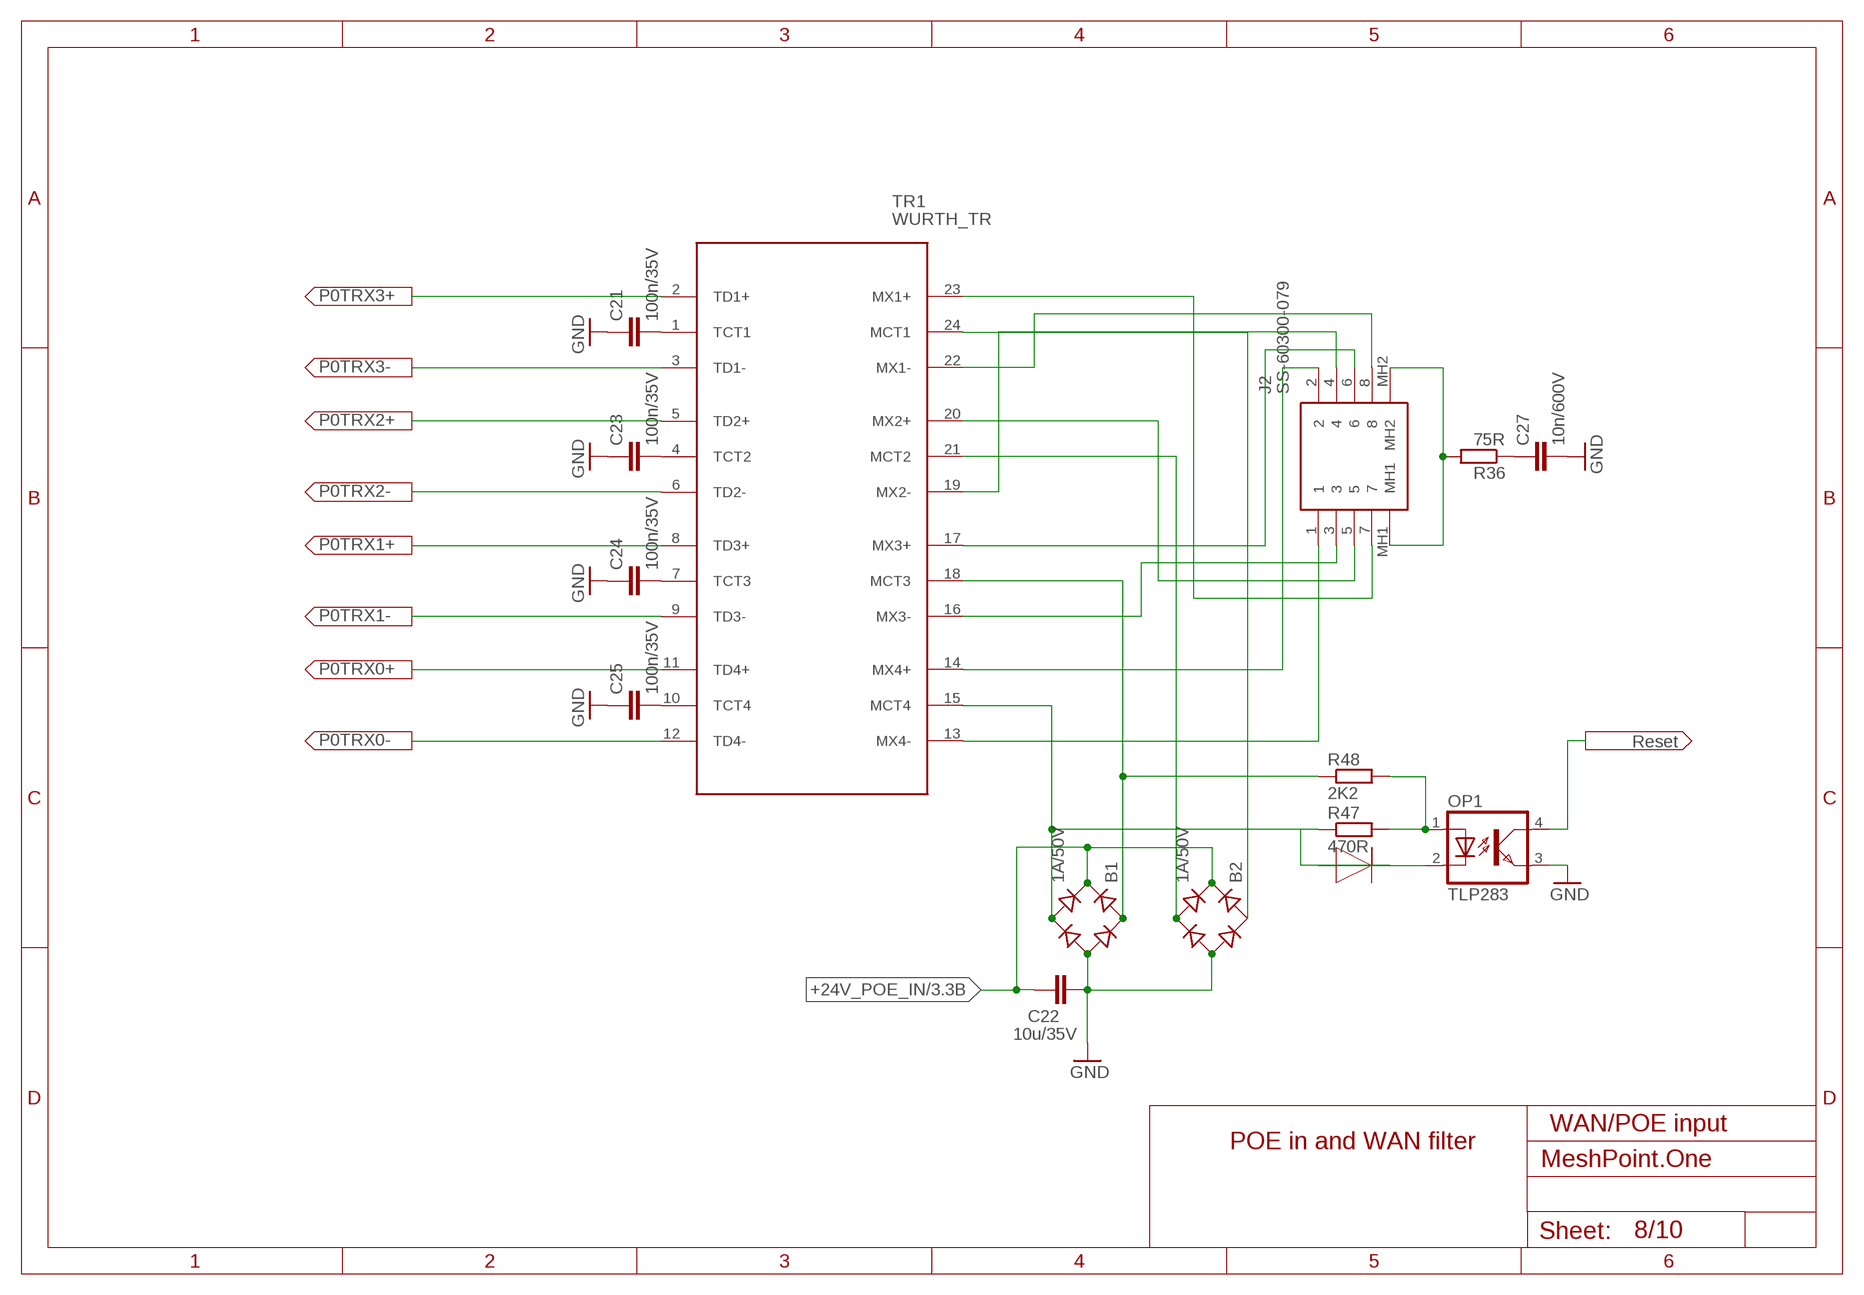
[diagram p7: schematic, sheet 8]

### Parts
B1  1A/50V  B1S  [MBS]
B2  1A/50V  B1S  [MBS]
C21  100n/35V  C-EUC0402  [C0402]
C22  10u/35V  C-EUC1206  [C1206]
C23  100n/35V  C-EUC0402  [C0402]
C24  100n/35V  C-EUC0402  [C0402]
C25  100n/35V  C-EUC0402  [C0402]
C27  10n/600V  C-EUC1206K  [C1206K]
J2  SS-60300-079  [SS60300079]
OP1  TLP283  [MINI-FLAT-4]
R36  75R  R-EU_M1206  [M1206]
R47  470R  R-EU_R0402  [R0402]
R48  2K2  R-EU_R0402  [R0402]
TR1  WURTH_TR  [WURTH1000T]
ZD3  BZT52C15S  [SOD2513X120N]

### Nets
+24V_POE_IN: B1.+ B2.+ C22.1 ; also sheet 3,4
GND: B1.- B2.- C21.1 C22.2 C23.1 C24.1 C25.1 C27.2 OP1.3(EMIT) ; also sheet 1,2,3,4,5,6,7,9,10
N$3: J2.2 TR1.14(MX4+)
N$4: J2.6 TR1.17(MX3+)
N$7: J2.4 TR1.19(MX2-)
N$20: J2.5 TR1.20(MX2+)
N$26: J2.3 TR1.16(MX3-)
N$33: J2.7 TR1.23(MX1+)
N$43: OP1.1(A) R47.2 R48.2
N$45: J2.8 TR1.22(MX1-)
N$46: J2.MH1 J2.MH2 R36.2
N$48: B1.AC1 R48.1 TR1.18(MCT3)
N$49: B2.AC2 TR1.21(MCT2)
N$52: C27.1 R36.1
N$53: OP1.2(C) ZD3.A
N$55: C21.2 TR1.1(TCT1)
N$56: C23.2 TR1.4(TCT2)
N$57: C24.2 TR1.7(TCT3)
N$62: C25.2 TR1.10(TCT4)
N$72: B2.AC1 TR1.24(MCT1)
N$76: J2.1 TR1.13(MX4-)
N$309: B1.AC2 R47.1 TR1.15(MCT4) ZD3.C
P0TRX0+: TR1.11(TD4+) ; also sheet 10
P0TRX0-: TR1.12(TD4-) ; also sheet 10
P0TRX1+: TR1.8(TD3+) ; also sheet 10
P0TRX1-: TR1.9(TD3-) ; also sheet 10
P0TRX2+: TR1.5(TD2+) ; also sheet 10
P0TRX2-: TR1.6(TD2-) ; also sheet 10
P0TRX3+: TR1.2(TD1+) ; also sheet 10
P0TRX3-: TR1.3(TD1-) ; also sheet 10
RESET: OP1.4(COL) ; also sheet 10

### Notes on the sheet
- WAN/POE input
- POE in and WAN filter

## Sheet 9 of 10: POE out and LAN filter
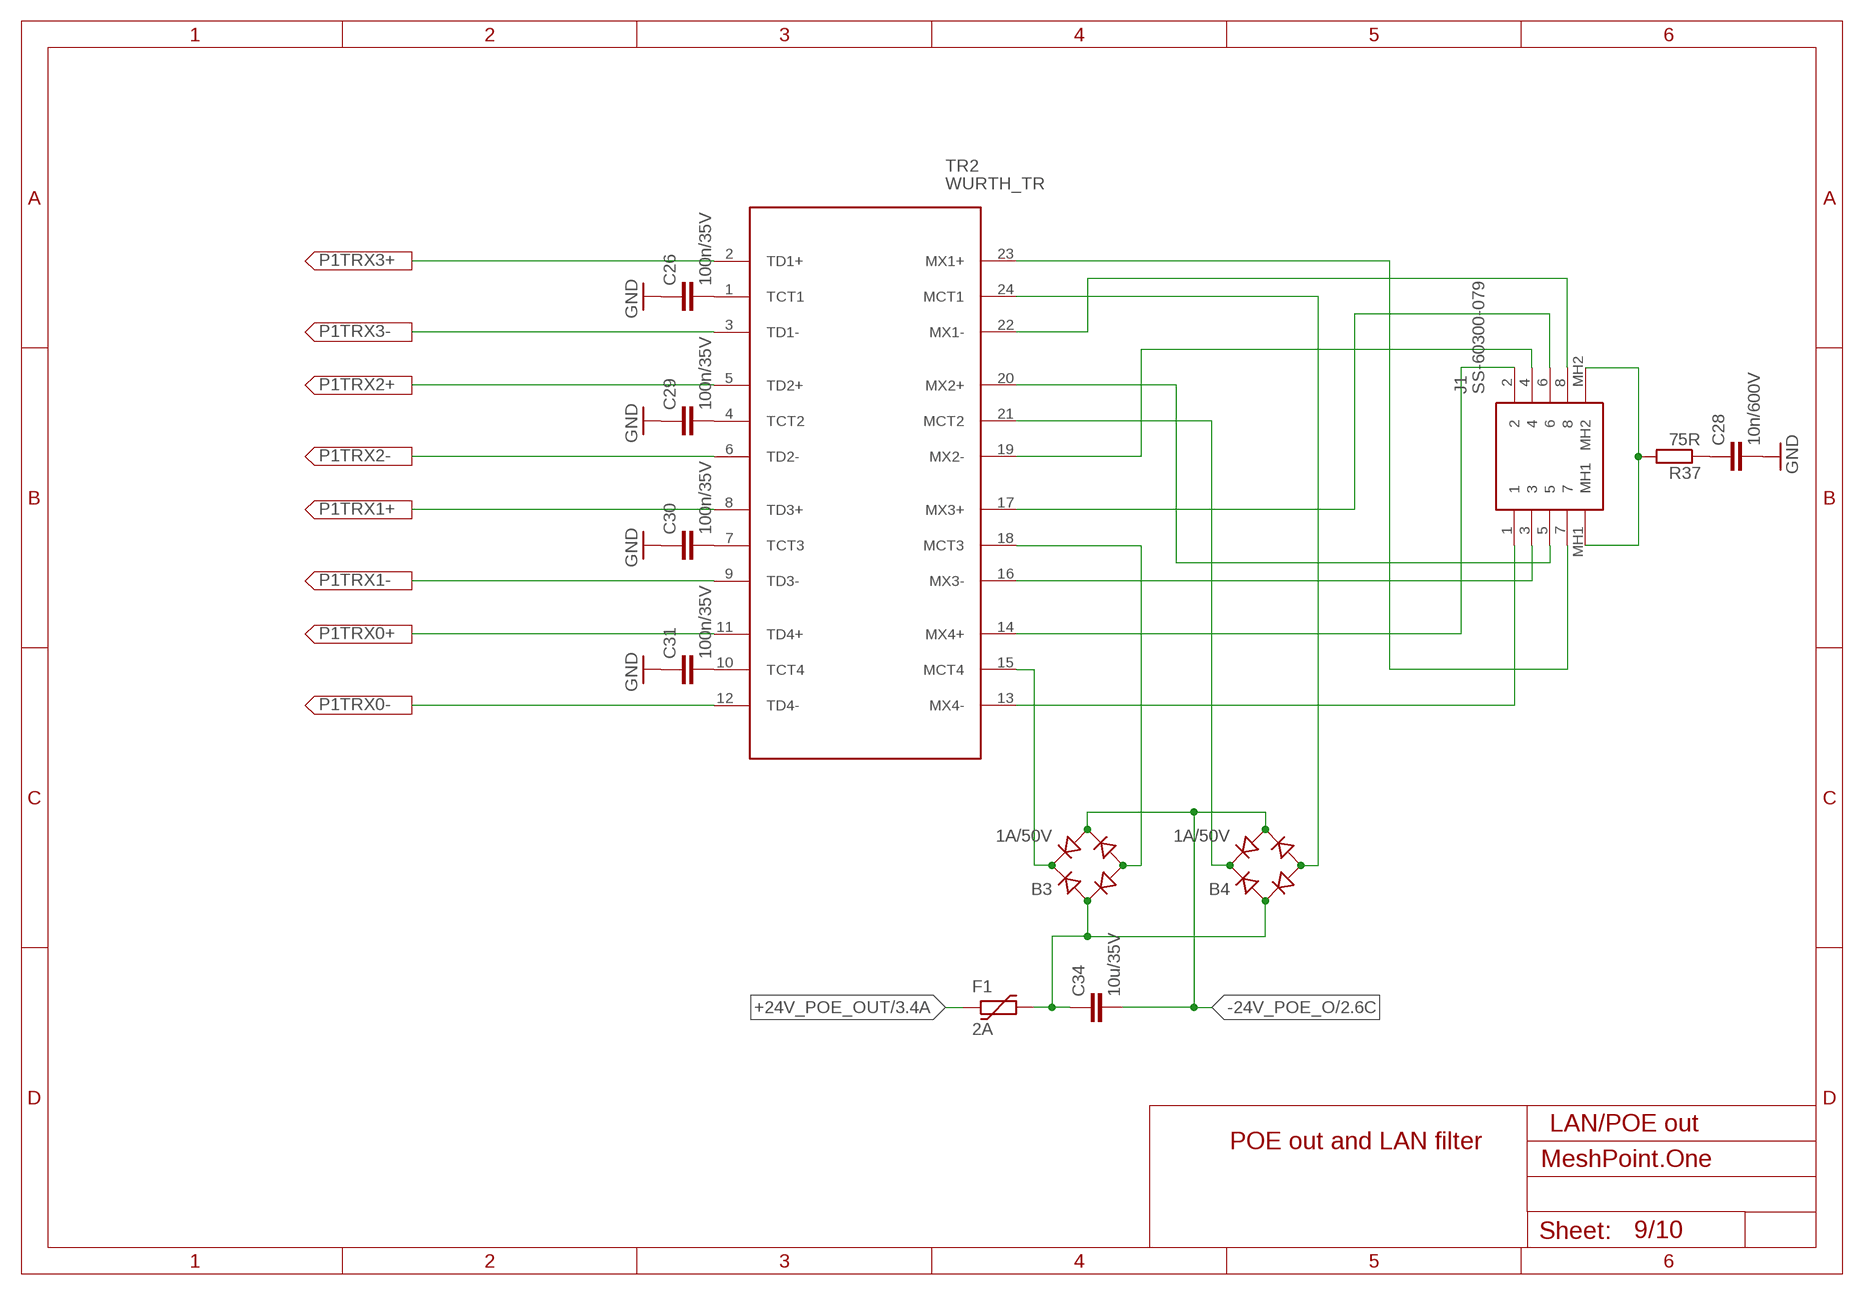
[diagram p8: schematic, sheet 9]

### Parts
B3  1A/50V  B1S  [MBS]
B4  1A/50V  B1S  [MBS]
C26  100n/35V  C-EUC0402  [C0402]
C28  10n/600V  C-EUC1206K  [C1206K]
C29  100n/35V  C-EUC0402  [C0402]
C30  100n/35V  C-EUC0402  [C0402]
C31  100n/35V  C-EUC0402  [C0402]
C34  10u/35V  C-EUC1206  [C1206]
F1  2A  FUSE_PTC-1812  [PTC1812L]
J1  SS-60300-079  [SS60300079]
R37  75R  R-EU_M1206  [M1206]
TR2  WURTH_TR  [WURTH1000T]

### Nets
+24V_POE_OUT: F1.1 ; also sheet 3
-24V_POE_O: B3.AC2 B4.AC2 C34.2 ; also sheet 2,10
GND: C26.1 C28.2 C29.1 C30.1 C31.1 ; also sheet 1,2,3,4,5,6,7,8,10
N$47: B4.+ TR2.21(MCT2)
N$50: J1.1 TR2.13(MX4-)
N$51: J1.2 TR2.14(MX4+)
N$63: J1.3 TR2.16(MX3-)
N$64: C28.1 R37.1
N$65: J1.4 TR2.19(MX2-)
N$66: J1.5 TR2.20(MX2+)
N$67: J1.6 TR2.17(MX3+)
N$68: J1.7 TR2.23(MX1+)
N$69: J1.8 TR2.22(MX1-)
N$70: J1.MH1 J1.MH2 R37.2
N$81: C26.2 TR2.1(TCT1)
N$82: C29.2 TR2.4(TCT2)
N$83: C30.2 TR2.7(TCT3)
N$84: C31.2 TR2.10(TCT4)
N$88: B3.+ TR2.15(MCT4)
N$90: B3.AC1 B4.AC1 C34.1 F1.2
N$251: B3.- TR2.18(MCT3)
N$310: B4.- TR2.24(MCT1)
P1TRX0+: TR2.11(TD4+) ; also sheet 10
P1TRX0-: TR2.12(TD4-) ; also sheet 10
P1TRX1+: TR2.8(TD3+) ; also sheet 10
P1TRX1-: TR2.9(TD3-) ; also sheet 10
P1TRX2+: TR2.5(TD2+) ; also sheet 10
P1TRX2-: TR2.6(TD2-) ; also sheet 10
P1TRX3+: TR2.2(TD1+) ; also sheet 10
P1TRX3-: TR2.3(TD1-) ; also sheet 10

### Notes on the sheet
- LAN/POE out
- POE out and LAN filter

## Sheet 10 of 10: Jalapeno
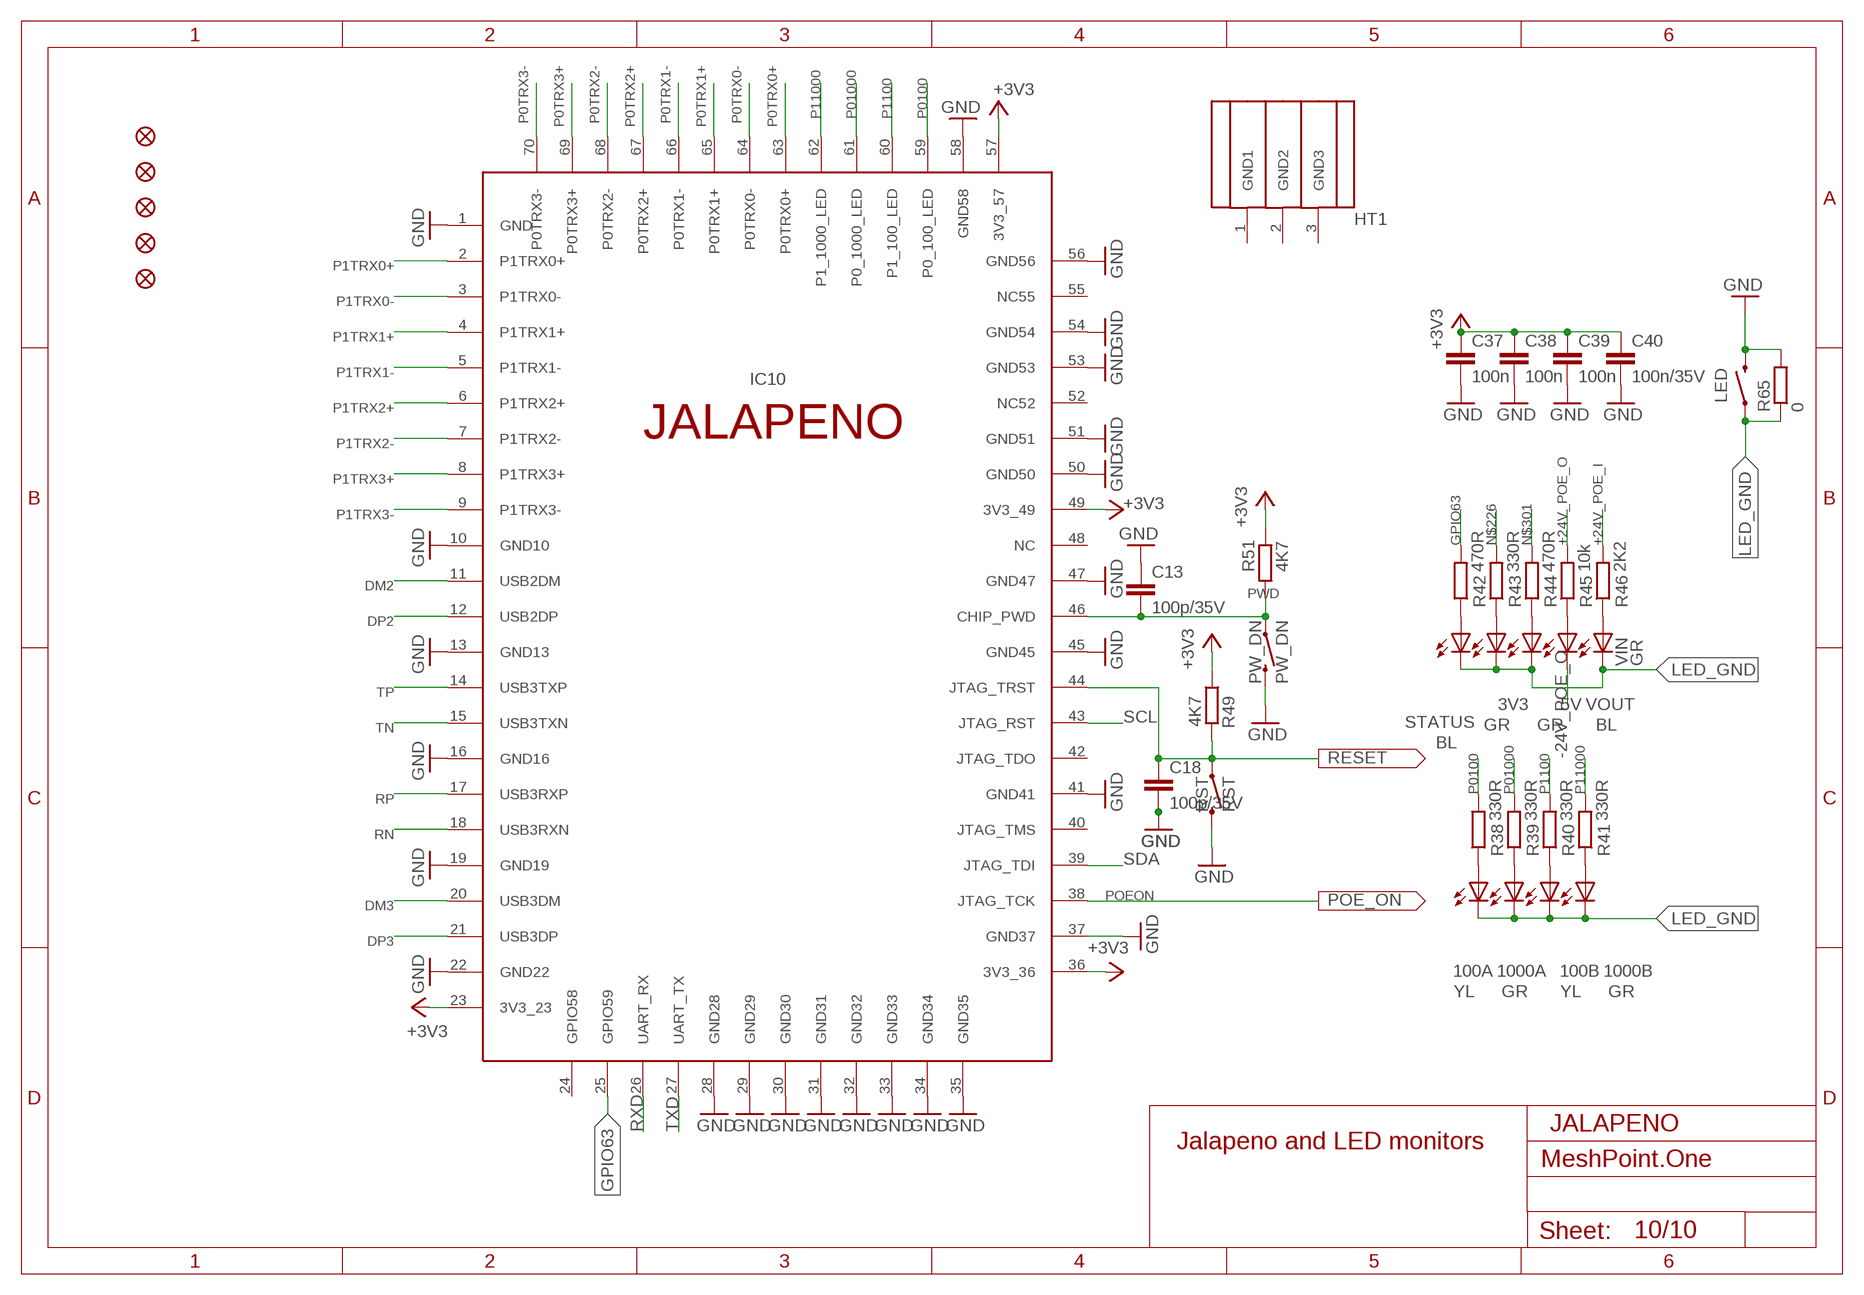
[diagram p9: schematic, sheet 10]

### Parts
3V3  GR  LEDCHIP-LED0603  [CHIP-LED0603]
5V  GR  LEDCHIP-LED0603  [CHIP-LED0603]
100A  YL  LEDCHIP-LED0603  [CHIP-LED0603]
100B  YL  LEDCHIP-LED0603  [CHIP-LED0603]
1000A  GR  LEDCHIP-LED0603  [CHIP-LED0603]
1000B  GR  LEDCHIP-LED0603  [CHIP-LED0603]
C13  100p/35V  C-EUC0402  [C0402]
C18  100p/35V  C-EUC0402  [C0402]
C37  100n  C-EUC0402  [C0402]
C38  100n  C-EUC0402  [C0402]
C39  100n  C-EUC0402  [C0402]
C40  100n/35V  C-EUC0402  [C0402]
FD1  FIDUCIALUFIDUCIAL  [FIDUCIAL-MICRO]
FD2  FIDUCIALUFIDUCIAL  [FIDUCIAL-MICRO]
FD3  FIDUCIALUFIDUCIAL  [FIDUCIAL-MICRO]
FD4  FIDUCIALUFIDUCIAL  [FIDUCIAL-MICRO]
FD5  FIDUCIALUFIDUCIAL  [FIDUCIAL-MICRO]
LED  MOMENTARY-SWITCH-SPST-SMD-4.6X2.8MM  [TACTILE_SWITCH_SMD_4.6X2.8MM]
PW_DN  PW_DN  MOMENTARY-SWITCH-SPST-SMD-4.6X2.8MM  [TACTILE_SWITCH_SMD_4.6X2.8MM]
R38  330R  R-EU_R0402  [R0402]
R39  330R  R-EU_R0402  [R0402]
R40  330R  R-EU_R0402  [R0402]
R41  330R  R-EU_R0402  [R0402]
R42  470R  R-EU_R0402  [R0402]
R43  330R  R-EU_R0402  [R0402]
R44  470R  R-EU_R0402  [R0402]
R45  10k  R-EU_R0402  [R0402]
R46  2K2  R-EU_R0402  [R0402]
R49  4K7  R-EU_R0402  [R0402]
R51  4K7  R-EU_R0402  [R0402]
R65  0  R-EU_M0805  [M0805]
RST  RST  MOMENTARY-SWITCH-SPST-SMD-4.6X2.8MM  [TACTILE_SWITCH_SMD_4.6X2.8MM]
STATUS  BL  LEDCHIP-LED0603  [CHIP-LED0603]
U$5  JALAPENO  [JALAPENO-PCB]
U$9  HEATSINK  [HEATSINK]
VIN  GR  LEDCHIP-LED0603  [CHIP-LED0603]
VOUT  BL  LEDCHIP-LED0603  [CHIP-LED0603]

### Nets
+24V_POE_I: R46.2 ; also sheet 1,2,3
+24V_POE_O: R45.2 ; also sheet 2,3
-24V_POE_O: VOUT.C ; also sheet 2,9
DM2: U$5.11(USB2DM) ; also sheet 5
DM3: U$5.20(USB3DM) ; also sheet 5
DP2: U$5.12(USB2DP) ; also sheet 5
DP3: U$5.21(USB3DP) ; also sheet 5
GND: C13.1 C18.2 C37.2 C38.2 C39.2 C40.2 LED.3 LED.4 PW_DN.3 PW_DN.4 R65.2 RST.3 RST.4 U$5.1(GND) U$5.10(GND10) U$5.13(GND13) U$5.16(GND16) U$5.19(GND19) U$5.22(GND22) U$5.28(GND28) U$5.29(GND29) U$5.30(GND30) U$5.31(GND31) U$5.32(GND32) U$5.33(GND33) U$5.34(GND34) U$5.35(GND35) U$5.37(GND37) U$5.41(GND41) U$5.45(GND45) U$5.47(GND47) U$5.50(GND50) U$5.51(GND51) U$5.53(GND53) U$5.54(GND54) U$5.56(GND56) U$5.58(GND58) ; also sheet 1,2,3,4,5,6,7,8,9
GPIO63: R42.2 U$5.25(GPIO59)
LED_GND: 3V3.C 5V.C 100A.C 100B.C 1000A.C 1000B.C LED.1 LED.2 R65.1 STATUS.C VIN.C
N$131: 100A.A R38.1
N$132: 1000A.A R39.1
N$133: 100B.A R40.1
N$134: 1000B.A R41.1
N$135: R42.1 STATUS.A
N$136: 3V3.A R43.1
N$137: 5V.A R44.1
N$138: R45.1 VOUT.A
N$139: R46.1 VIN.A
N$226: C37.1 C38.1 C39.1 C40.1 R43.2 R49.1 R51.2 U$5.23(3V3_23) U$5.36(3V3_36) U$5.49(3V3_49) U$5.57(3V3_57) ; supply symbol labelled +3V3 ; also sheet 1,3,6,7
N$301: R44.2 ; also sheet 1,5
P0TRX0+: U$5.63(P0TRX0+) ; also sheet 8
P0TRX0-: U$5.64(P0TRX0-) ; also sheet 8
P0TRX1+: U$5.65(P0TRX1+) ; also sheet 8
P0TRX1-: U$5.66(P0TRX1-) ; also sheet 8
P0TRX2+: U$5.67(P0TRX2+) ; also sheet 8
P0TRX2-: U$5.68(P0TRX2-) ; also sheet 8
P0TRX3+: U$5.69(P0TRX3+) ; also sheet 8
P0TRX3-: U$5.70(P0TRX3-) ; also sheet 8
P1TRX0+: U$5.2(P1TRX0+) ; also sheet 9
P1TRX0-: U$5.3(P1TRX0-) ; also sheet 9
P1TRX1+: U$5.4(P1TRX1+) ; also sheet 9
P1TRX1-: U$5.5(P1TRX1-) ; also sheet 9
P1TRX2+: U$5.6(P1TRX2+) ; also sheet 9
P1TRX2-: U$5.7(P1TRX2-) ; also sheet 9
P1TRX3+: U$5.8(P1TRX3+) ; also sheet 9
P1TRX3-: U$5.9(P1TRX3-) ; also sheet 9
P0100: R38.2 U$5.59(P0_100_LED)
P01000: R39.2 U$5.61(P0_1000_LED)
P1100: R40.2 U$5.60(P1_100_LED)
P11000: R41.2 U$5.62(P1_1000_LED)
POEON: U$5.38(JTAG_TCK) ; also sheet 2
PWD: C13.2 PW_DN.1 PW_DN.2 R51.1 U$5.46(CHIP_PWD)
RESET: C18.1 R49.2 RST.1 RST.2 U$5.44(JTAG_TRST) ; also sheet 8
RN: U$5.18(USB3RXN) ; also sheet 5
RP: U$5.17(USB3RXP) ; also sheet 5
RXD: U$5.26(UART_RX) ; also sheet 6
SCL: U$5.43(JTAG_RST) ; also sheet 3,4,6,7
SDA: U$5.39(JTAG_TDI) ; also sheet 3,4,6,7
TN: U$5.15(USB3TXN) ; also sheet 5
TP: U$5.14(USB3TXP) ; also sheet 5
TXD: U$5.27(UART_TX) ; also sheet 6
Unconnected: U$5.24(GPIO58) U$5.40(JTAG_TMS) U$5.42(JTAG_TDO) U$5.48(NC) U$5.52(NC52) U$5.55(NC55) U$9.1(GND1) U$9.2(GND2) U$9.3(GND3)

### Notes on the sheet
- HT1
- IC10
- JALAPENO
- Jalapeno and LED monitors

## Library data of the parts
3V3 5V 100A 100B 1000A 1000B STATUS VIN VOUT = led:LED: LED OSRAM: - CHIPLED LG R971, LG N971, LY N971, LG Q971, LY Q971, LO R971, LY R971 LH N974, LH R974 LS Q976, LO Q976, LY Q976 LO Q996 - Hyper CHIPLED LW Q18S LB Q993, LB Q99A, LB R99A - SideLED LS A670, LO A670, LY A670, LG A670, LP A670 LB A673, LV A673, LT A673, LW A673 LH A674 LY A675 LS A676, LA A676, LO A676, LY A676, LW A676 LS A679, LY A679, LG A679 - Hyper Micro SIDELED® LS Y876, LA Y876, LO Y876, LY Y876 LT Y87S - SmartLED LW L88C, LW L88S LB L89C, LB L89S, LG L890 LS L89K, LO L89K, LY L89K LS L896, LA L896, LO L896, LY L896 - TOPLED LS T670, LO T670, LY T670, LG T670, LP T670 LSG T670, LSP T670, LSY T670, LOP T670, LYG T670 LG T671, LOG T671, LSG T671 LB T673, LV T673, LT T673, LW T673 LH T674 LS T676, LA T676, LO T676, LY T676, LB T676, LH T676, LSB T676, LW T676 LB T67C, LV T67C, LT T67C, LS T67K, LO T67K, LY T67K, LW E67C LS E67B, LA E67B, LO E67B, LY E67B, LB E67C, LV E67C, LT E67C LW T67C LS T679, LY T679, LG T679 LS T770, LO T770, LY T770, LG T770, LP T770 LB T773, LV T773, LT T773, LW T773 LH T774 LS E675, LA E675, LY E675, LS T675 LS T776, LA T776, LO T776, LY T776, LB T776 LHGB T686 LT T68C, LB T68C - Hyper Mini TOPLED® LB M676 - Mini TOPLED Santana® LG M470 LS M47K, LO M47K, LY M47K Source: http://www.osram.convergy.de LUXEON: - LUMILED® LXK2-PW12-R00, LXK2-PW12-S00, LXK2-PW14-U00, LXK2-PW14-V00 LXK2-PM12-R00, LXK2-PM12-S00, LXK2-PM14-U00 LXK2-PE12-Q00, LXK2-PE12-R00, LXK2-PE12-S00, LXK2-PE14-T00, LXK2-PE14-U00 LXK2-PB12-K00, LXK2-PB12-L00, LXK2-PB12-M00, LXK2-PB14-N00, LXK2-PB14-P00, LXK2-PB14-Q00 LXK2-PR12-L00, LXK2-PR12-M00, LXK2-PR14-Q00, LXK2-PR14-R00 LXK2-PD12-Q00, LXK2-PD12-R00, LXK2-PD12-S00 LXK2-PH12-R00, LXK2-PH12-S00 LXK2-PL12-P00, LXK2-PL12-Q00, LXK2-PL12-R00 Source: www.luxeon.com KINGBRIGHT: KA-3528ASYC Source: www.kingbright.com
B1-B4 = rectifier:B*S: Surface Mount Glass Passivated Bridge Rectifiers Source: Comchip Bridge Rectifiers B05S-G_B10S-G.pdf
BATT = con-amp-quick:M06: AMP QUICK CONNECTOR; OC_FARNELL: unknown; OC_NEWARK: unknown
BATT1 = ERADIONICA:BATERIJA_CR1220
C1-C7 C36 C42 C44 C45 C54-C58 = resistor:C-EU: CAPACITOR, European symbol
C8 C9 C11 C13-C35 C37-C41 C43 C46 C47 C66 = rcl:C-EU: CAPACITOR, European symbol
C10 C12 C71 = rcl:CPOL-EU: POLARIZED CAPACITOR, European symbol
CN2 = e-radionica_E-R MADE:EASYC
D1 = diode:DIODE-: DIODE
F1 = dp_devices:FUSE_PTC: Resettable PTC
FD1-FD5 = SparkFun-Aesthetics:FIDUCIAL: Fiducial Alignment Points Point-of-reference for pick-and-place machines and other optical instruments.
IC2 = TL494 TSSOP:TL494_PW_16
IC3 IC4 = INA230:INA230_RGT_16; MANUFACTURER_PART_NUMBER: ina230_rgt_16; VENDOR: TEXAS INSTRUMENTS
IC5 = LTC4412HVI:LTC4412
IC6 = TPS2052DGN:TPS2052B_DGN_8; MANUFACTURER_PART_NUMBER: tps2052b_dgn_8; VENDOR: Texas Instruments
IC7 = microbuilder:BME280: BME280 - Environmental Sensor (I2C + SPI)
IC9 = PCF2129:PCF2129-16DF
IC10 = CH330N:CH330N
IC11 = TPS2662:TPS26623DRCR
J1 J2 = SS-60300-079:SS-60300-079: Modular Connectors / Ethernet Connectors R ANG SHIELDED JACK Source: Datasheet <https://www.belfuse.com/resources/drawings/stewartconnector/dr-stw-ss-60300-079.pdf>; DESCRIPTION: Modular Connectors / Ethernet Connectors R ANG SHIELDED JACK; HEIGHT: 12.73mm; MANUFACTURER_NAME: Bel; MANUFACTURER_PART_NUMBER: SS-60300-079; MOUSER_PART_NUMBER: 530-SS-60300-079
L1 L2 = Moje:PA4333.102NLT
L3 = inductors:DR125: High Power Density, High Efficiency, Shielded Inductors Source: coiltronics_dr_series.pdf
L4-L11 R1 R2 R11-R17 R19-R55 R59-R61 R63-R74 = rcl:R-EU_: RESISTOR, European symbol
LED PW_DN RST = SparkFun-Switches:MOMENTARY-SWITCH-SPST: Momentary Switch (Pushbutton) - SPST Normally-open (NO) SPST momentary switches (buttons, pushbuttons). Variants PTH-12MM - 12mm square, through-hole Momentary Pushbutton Switch - 12mm Square <https://www.sparkfun.com/products/9190> (COM-09190) PTH-6.0MM, PTH-6.0MM-KIT - 6.0mm square, through-hole Mini Pushbutton Switch <https://www.sparkfun.com/products/97> (COM-00097) KIT package intended for soldering kit's - only one side of pads' copper is exposed. PTH-RIGHT-ANGLE-KIT - Right-angle, through-hole Right Angle Tactile Button <https://www.sparkfun.com/products/10791> - Used on SparkFun BigTime Watch Kit <https://www.sparkfun.com/products/11734> SMD-12MM - 12mm square, surface-mount Tactile Button - SMD (12mm) <https://www.sparkfun.com/products/12993> (COM-12993) Used on SparkFun PicoBoard <https://www.sparkfun.com/products/11888> SMD-4.5MM - 4.5mm Square Trackball Switch Used on SparkFun Blackberry Trackballer Breakout <https://www.sparkfun.com/products/13169> SMD-4.6MMX2.8MM - 4.60mm x 2.80mm, surface mount Used on SparkFun SAMD21 Mini Breakout <https://www.sparkfun.com/products/13664> SMD-5.2MM, SMD-5.2-REDUNDANT - 5.2mm square, surface-mount Mini Pushbutton Switch - SMD <https://www.sparkfun.com/products/8720> (COM-08720) Used on Arduino Pro Mini <https://www.sparkfun.com/products/11114> REDUNDANT package connects both switch circuits together SMD-6.0X3.5MM - 6.0 x 3.5mm, surface mount Momentary Reset Switch SMD <https://www.sparkfun.com/products/8229> (COM-08229) SMD-6.2MM-TALL - 6.2mm square, surface mount Tactile Button - SMD (6mm) <https://www.sparkfun.com/products/12992> Used on SparkFun Digital Sandbox <https://www.sparkfun.com/products/12651> SMD-RIGHT-ANGLE - Right-angle, surface mount Used on SparkFun Block for Intel® Edison - Arduino <https://www.sparkfun.com/products/13036>; PROD_ID: SWCH-13065
OP1 = optocoupler:TLP283: TOSHIBA PHOTOCOUPLER GaAs IRED & PHOTO-TRANSISTOR Source: http://www.semicon.toshiba.co.jp/td/en/Opto/Photocoupler/en_20050928_TLP283_datasheet.pdf; OC_FARNELL: unknown; OC_NEWARK: unknown
Q1 Q2 Q5 Q15 = transistor-npn:BC847*: NPN Transistor
Q6 = transistor-pnp:BC857*: PNP Transistror
Q7 Q9 = transistor-power:BSZ105N04NS: OptiMOS (TM)3 Power-Transistor N-Channel, Normal level Source : Data sheet <http://www.infineon.com/dgdl/BSZ105N04NSG_rev1.1.pdf?folderId=db3a3043156fd5730115c7d50620107c&fileId=db3a30431689f4420116c485c67f084e>
Q11 = BMS:SMD-MOSFET-P-CH-8V-4.1A-CJ2305(SOT-23): 305030014; MPN: CJ2305; VALUE: CJ2305
R3-R10 R62 = resistor:R-US_: RESISTOR, American symbol
TR1 TR2 = Wurth transformer:WURTH_TR
U1 = LT8650SEV_PBF:LT8650SEV#PBF: LT8650S - Dual Channel 4A, 42V, Synchronous Step-Down Silent Switcher 2 with 6.2µA Quiescent Current; AVAILABILITY: Unavailable; DESCRIPTION: LT8650S - Dual Channel 4A, 42V, Synchronous Step-Down Silent Switcher 2 with 6.2µA Quiescent Current; MF: Linear Technology/Analog; MP: LT8650SEV#PBF; PACKAGE: LQFN-32 Linear Technology; PRICE: None
U2 U3 = SI4435DYTRPBF:SI4435DYTRPBF: None; AVAILABILITY: Unavailable; DESCRIPTION: Single P-Channel 30 V 2.5 W 40 nC Hexfet Power Mosfet Surface Mount - SOIC-8; MF: Infineon Technologies; MP: SI4435DYTRPBF; PACKAGE: SOIC-8 Infineon Technologies; PRICE: None
U$5 = Jalapeno:JALAPENO
U$9 = Heatsink:HEATSINK
U_ART = usb_con-update:MOLEX-47346-0001: MICRO USB B, BOTTOM MOUNT
USB3.0 = USB3.0:USB3.0D
ZD3 = SOD2513X120N:BZT52C15S